# Altium project APE - Single Board Computer.PrjPcb (part 1 of 3)
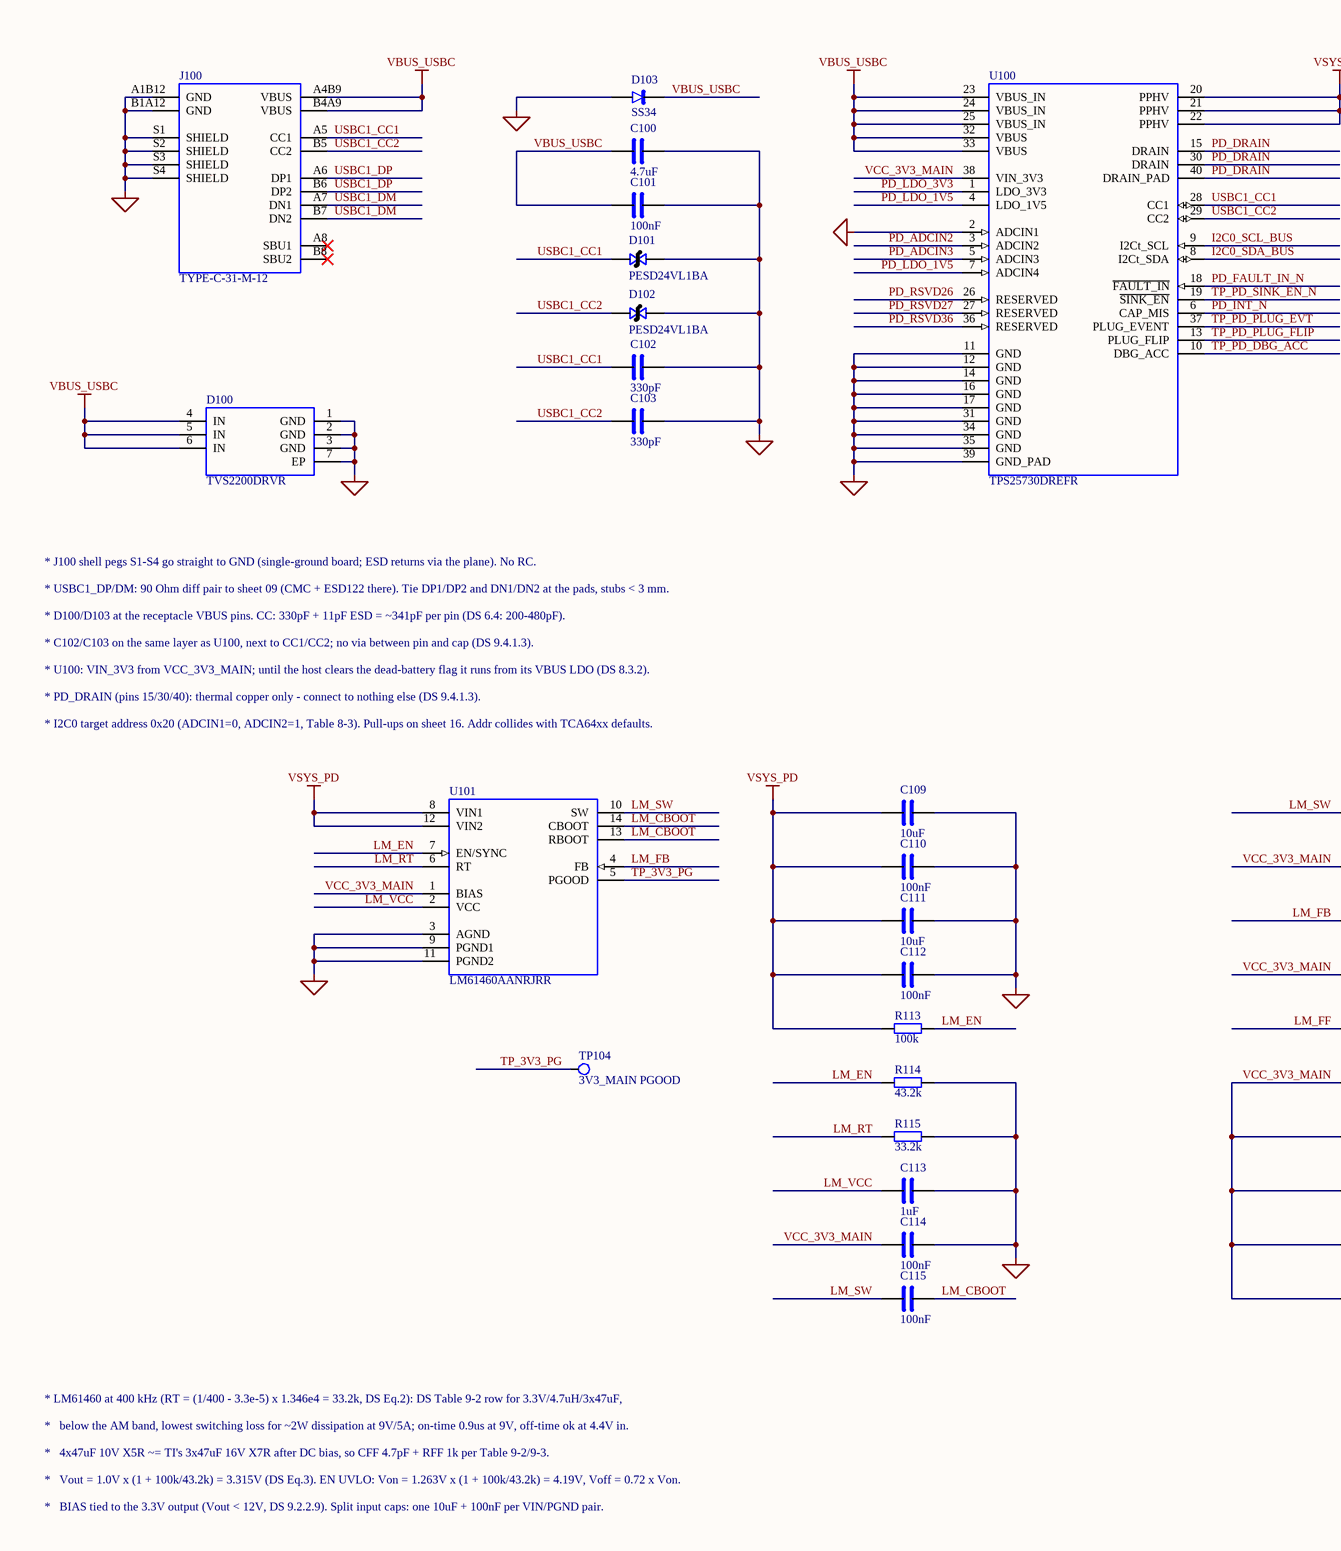
[diagram p0: 01_Power_Input.SchDoc, left]
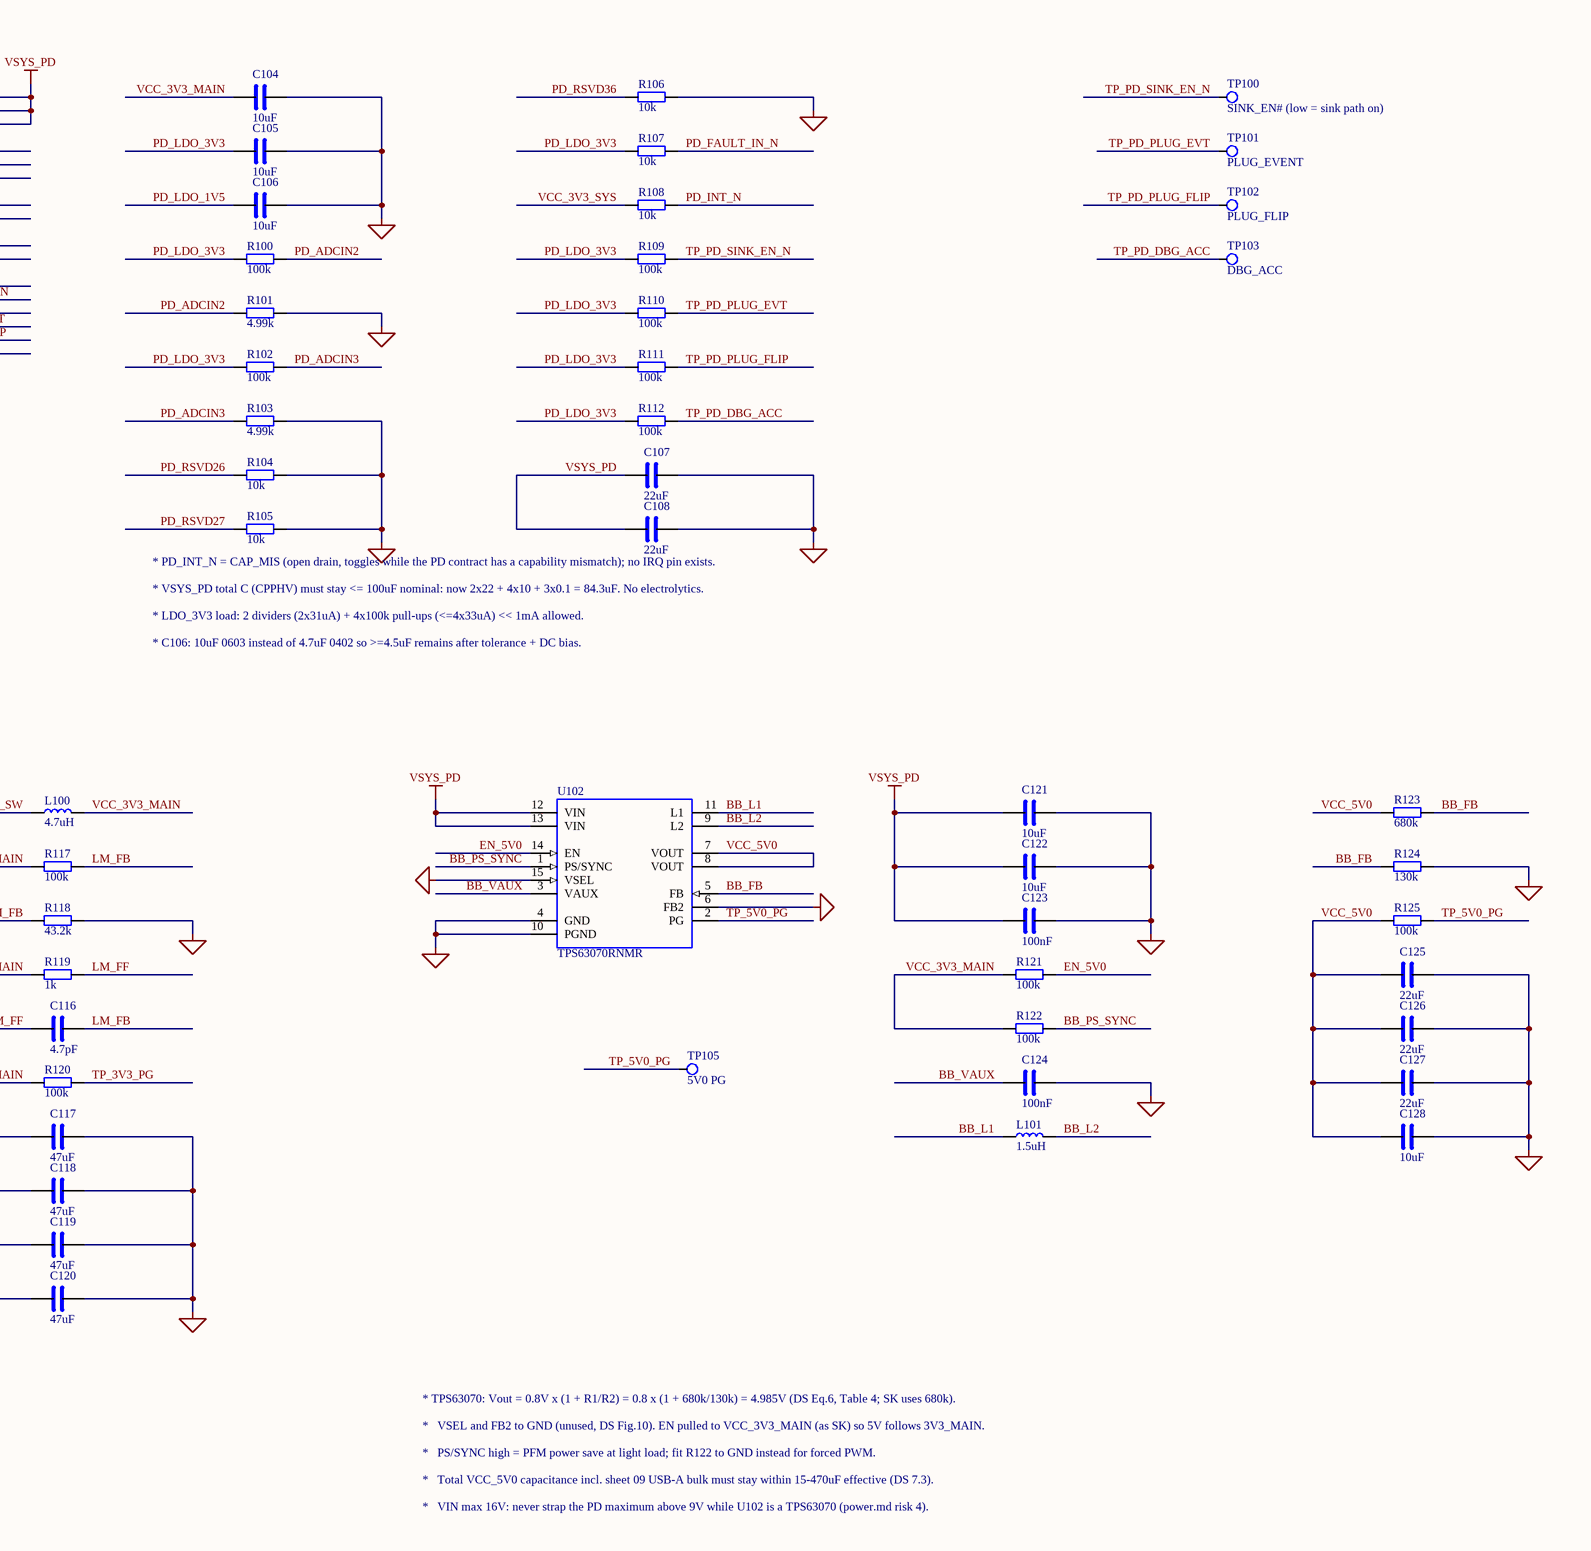
[diagram p1: 01_Power_Input.SchDoc, right]
16 sheets, 660 parts. Net scope: global (net labels, ports and power ports of the same name join across sheets).
Board file: PCB.PcbDoc
Sheets:
  01_Power_Input.SchDoc
  02_PMIC.SchDoc
  03_SiP_Power.SchDoc
  04_SiP_GND_NC.SchDoc
  05_SiP_IO.SchDoc
  06_Clock_Reset_Boot.SchDoc
  07_Storage.SchDoc
  08_Ethernet.SchDoc
  09_USB.SchDoc
  10_HDMI.SchDoc
  11_Audio.SchDoc
  12_Camera.SchDoc
  13_Wireless.SchDoc
  14_Expansion.SchDoc
  15_Debug.SchDoc
  16_Misc.SchDoc

## Sheet 01_Power_Input.SchDoc
size 812 x 508 mm; SheetNumber: 1; SheetTotal: 16

### Parts
C100  4.7uF  [C0805]
C101  100nF  [C0603]
C102  330pF  [C0402]
C103  330pF  [C0402]
C104  10uF  [C0603]
C105  10uF  [C0603]
C106  10uF  [C0603]
C107  22uF  [C1206]
C108  22uF  [C1206]
C109  10uF  [C1206]
C110  100nF  [C0603]
C111  10uF  [C1206]
C112  100nF  [C0603]
C113  1uF  [C0402]
C114  100nF  [C0402]
C115  100nF  [C0402]
C116  4.7pF  [C0402]
C117  47uF  [C1206]
C118  47uF  [C1206]
C119  47uF  [C1206]
C120  47uF  [C1206]
C121  10uF  [C0805]
C122  10uF  [C0805]
C123  100nF  [C0603]
C124  100nF  [C0402]
C125  22uF  [C1206]
C126  22uF  [C1206]
C127  22uF  [C1206]
C128  10uF  [C0603]
D100  TVS2200DRVR  [WSON6_DRV_2X2]
D101  PESD24VL1BA  [SOD323]
D102  PESD24VL1BA  [SOD323]
D103  SS34  [DIO_SMA]
J100  TYPE-C-31-M-12  [USB-C_HRO_TYPE-C-31-M-12]
L100  4.7uH  [IND_SUNLORD_MWSA0603S]
L101  1.5uH  [IND_SUNLORD_MWSA0402S]
R100  100k  [R0402]
R101  4.99k  [R0402]
R102  100k  [R0402]
R103  4.99k  [R0402]
R104  10k  [R0402]
R105  10k  [R0402]
R106  10k  [R0402]
R107  10k  [R0402]
R108  10k  [R0402]
R109  100k  [R0402]
R110  100k  [R0402]
R111  100k  [R0402]
R112  100k  [R0402]
R113  100k  [R0402]
R114  43.2k  [R0402]
R115  33.2k  [R0402]
R117  100k  [R0402]
R118  43.2k  [R0402]
R119  1k  [R0402]
R120  100k  [R0402]
R121  100k  [R0402]
R122  100k  [R0402]
R123  680k  [R0402]
R124  130k  [R0402]
R125  100k  [R0402]
TP100  SINK_EN# (low = sink path on)  [TP_PAD_1.0]
TP101  PLUG_EVENT  [TP_PAD_1.0]
TP102  PLUG_FLIP  [TP_PAD_1.0]
TP103  DBG_ACC  [TP_PAD_1.0]
TP104  3V3_MAIN PGOOD  [TP_PAD_1.0]
TP105  5V0 PG  [TP_PAD_1.0]
U100  TPS25730DREFR  [WQFN38_REF_4X6]
U101  LM61460AANRJRR  [VQFN-HR14_RJR_3.5X4]
U102  TPS63070RNMR  [VQFN-HR15_RNM_2.5X3]

### Nets
GND: C100.2 C101.2 C102.2 C103.2 C104.2 C105.2 C106.2 C107.2 C108.2 C109.2 C110.2 C111.2 C112.2 C113.2 C114.2 C117.2 C118.2 C119.2 C120.2 C121.2 C122.2 C123.2 C124.2 C125.2 C126.2 C127.2 C128.2 D100.1(GND) D100.2(GND) D100.3(GND) D100.7(EP) D101.2 D102.2 D103.1(A) J100.A1B12(GND) J100.B1A12(GND) J100.S1(SHIELD) J100.S2(SHIELD) J100.S3(SHIELD) J100.S4(SHIELD) R101.2 R103.2 R104.2 R105.2 R106.2 R114.2 R115.2 R118.2 R124.2 U100.2(ADCIN1) U100.11(GND) U100.12(GND) U100.14(GND) U100.16(GND) U100.17(GND) U100.31(GND) U100.34(GND) U100.35(GND) U100.39(GND_PAD) U101.3(AGND) U101.9(PGND1) U101.11(PGND2) U102.4(GND) U102.6(FB2) U102.10(PGND) U102.15(VSEL)
VBUS_USBC: C100.1 C101.1 D100.4(IN) D100.5(IN) D100.6(IN) D103.2(K) J100.A4B9(VBUS) J100.B4A9(VBUS) U100.23(VBUS_IN) U100.24(VBUS_IN) U100.25(VBUS_IN) U100.32(VBUS) U100.33(VBUS)
VCC_3V3_MAIN: C104.1 C114.1 C117.1 C118.1 C119.1 C120.1 L100.2 R117.1 R119.1 R120.1 R121.1 R122.1 U100.38(VIN_3V3) U101.1(BIAS)
VCC_3V3_SYS: R108.1
VCC_5V0: C125.1 C126.1 C127.1 C128.1 R123.1 R125.1 U102.7(VOUT) U102.8(VOUT)
VSYS_PD: C107.1 C108.1 C109.1 C110.1 C111.1 C112.1 C121.1 C122.1 C123.1 R113.1 U100.20(PPHV) U100.21(PPHV) U100.22(PPHV) U101.8(VIN1) U101.12(VIN2) U102.12(VIN) U102.13(VIN)
BB_FB: R123.2 R124.1 U102.5(FB)
BB_L1: L101.1 U102.11(L1)
BB_L2: L101.2 U102.9(L2)
BB_PS_SYNC: R122.2 U102.1(PS/SYNC)
BB_VAUX: C124.1 U102.3(VAUX)
EN_5V0: R121.2 U102.14(EN)
I2C0_SCL_BUS: U100.9(I2Ct_SCL)
I2C0_SDA_BUS: U100.8(I2Ct_SDA)
LM_CBOOT: C115.2 U101.13(RBOOT) U101.14(CBOOT)
LM_EN: R113.2 R114.1 U101.7(EN/SYNC)
LM_FB: C116.2 R117.2 R118.1 U101.4(FB)
LM_FF: C116.1 R119.2
LM_RT: R115.1 U101.6(RT)
LM_SW: C115.1 L100.1 U101.10(SW)
LM_VCC: C113.1 U101.2(VCC)
PD_ADCIN2: R100.2 R101.1 U100.3(ADCIN2)
PD_ADCIN3: R102.2 R103.1 U100.5(ADCIN3)
PD_DRAIN: U100.15(DRAIN) U100.30(DRAIN) U100.40(DRAIN_PAD)
PD_FAULT_IN_N: R107.2 U100.18(~{FAULT_IN})
PD_INT_N: R108.2 U100.6(CAP_MIS)
PD_LDO_1V5: C106.1 U100.4(LDO_1V5) U100.7(ADCIN4)
PD_LDO_3V3: C105.1 R100.1 R102.1 R107.1 R109.1 R110.1 R111.1 R112.1 U100.1(LDO_3V3)
PD_RSVD26: R104.1 U100.26(RESERVED)
PD_RSVD27: R105.1 U100.27(RESERVED)
PD_RSVD36: R106.1 U100.36(RESERVED)
TP_3V3_PG: R120.2 TP104.1(TP) U101.5(PGOOD)
TP_5V0_PG: R125.2 TP105.1(TP) U102.2(PG)
TP_PD_DBG_ACC: R112.2 TP103.1(TP) U100.10(DBG_ACC)
TP_PD_PLUG_EVT: R110.2 TP101.1(TP) U100.37(PLUG_EVENT)
TP_PD_PLUG_FLIP: R111.2 TP102.1(TP) U100.13(PLUG_FLIP)
TP_PD_SINK_EN_N: R109.2 TP100.1(TP) U100.19(~{SINK_EN})
USBC1_CC1: C102.1 D101.1 J100.A5(CC1) U100.28(CC1)
USBC1_CC2: C103.1 D102.1 J100.B5(CC2) U100.29(CC2)
USBC1_DM: J100.A7(DN1) J100.B7(DN2)
USBC1_DP: J100.A6(DP1) J100.B6(DP2)

Not connected (* = marked no-connect by the designer): J100 A8(SBU1)* B8(SBU2)*

### Notes on the sheet
- * J100 shell pegs S1-S4 go straight to GND (single-ground board; ESD returns via the plane). No RC.
- * USBC1_DP/DM: 90 Ohm diff pair to sheet 09 (CMC + ESD122 there). Tie DP1/DP2 and DN1/DN2 at the pads, stubs < 3 mm.
- * PD_INT_N = CAP_MIS (open drain, toggles while the PD contract has a capability mismatch); no IRQ pin exists.
- * VSYS_PD total C (CPPHV) must stay <= 100uF nominal: now 2x22 + 4x10 + 3x0.1 = 84.3uF. No electrolytics.
- * D100/D103 at the receptacle VBUS pins. CC: 330pF + 11pF ESD = ~341pF per pin (DS 6.4: 200-480pF).
- * C102/C103 on the same layer as U100, next to CC1/CC2; no via between pin and cap (DS 9.4.1.3).
- * U100: VIN_3V3 from VCC_3V3_MAIN; until the host clears the dead-battery flag it runs from its VBUS LDO (DS 8.3.2).
- * LDO_3V3 load: 2 dividers (2x31uA) + 4x100k pull-ups (<=4x33uA) << 1mA allowed.
- * C106: 10uF 0603 instead of 4.7uF 0402 so >=4.5uF remains after tolerance + DC bias.
- * PD_DRAIN (pins 15/30/40): thermal copper only - connect to nothing else (DS 9.4.1.3).
- * I2C0 target address 0x20 (ADCIN1=0, ADCIN2=1, Table 8-3). Pull-ups on sheet 16. Addr collides with TCA64xx defaults.
- * LM61460 at 400 kHz (RT = (1/400 - 3.3e-5) x 1.346e4 = 33.2k, DS Eq.2): DS Table 9-2 row for 3.3V/4.7uH/3x47uF,
- * TPS63070: Vout = 0.8V x (1 + R1/R2) = 0.8 x (1 + 680k/130k) = 4.985V (DS Eq.6, Table 4; SK uses 680k).
- *   below the AM band, lowest switching loss for ~2W dissipation at 9V/5A; on-time 0.9us at 9V, off-time ok at 4.4V in.
- *   4x47uF 10V X5R ~= TI's 3x47uF 16V X7R after DC bias, so CFF 4.7pF + RFF 1k per Table 9-2/9-3.
- *   Vout = 1.0V x (1 + 100k/43.2k) = 3.315V (DS Eq.3). EN UVLO: Von = 1.263V x (1 + 100k/43.2k) = 4.19V, Voff = 0.72 x Von.
- *   VSEL and FB2 to GND (unused, DS Fig.10). EN pulled to VCC_3V3_MAIN (as SK) so 5V follows 3V3_MAIN.
- *   PS/SYNC high = PFM power save at light load; fit R122 to GND instead for forced PWM.
- *   Total VCC_5V0 capacitance incl. sheet 09 USB-A bulk must stay within 15-470uF effective (DS 7.3).
- *   BIAS tied to the 3.3V output (Vout < 12V, DS 9.2.2.9). Split input caps: one 10uF + 100nF per VIN/PGND pair.
- *   VIN max 16V: never strap the PD maximum above 9V while U102 is a TPS63070 (power.md risk 4).

### Library data of the parts
C100 = CAP: Capacitor, non-polarized; MPN: CL21A475KAQNNNE; Manufacturer: Samsung; Spec: 4.7uF 25V X5R 0805 (CVBUS; total VBUS C must stay <= 10 uF)
C101 = CAP: Capacitor, non-polarized; MPN: CC0603KRX7R9BB104; Manufacturer: YAGEO; Spec: 100nF 50V X7R 0603 (VBUS HF)
C102 C103 = CAP: Capacitor, non-polarized; Spec: 330pF 50V C0G 0402 (CCCy)
C104 = CAP: Capacitor, non-polarized; MPN: CL10A106KP8NNNC; Manufacturer: Samsung; Spec: 10uF 10V X5R 0603 (CVIN_3V3)
C105 = CAP: Capacitor, non-polarized; MPN: CL10A106KP8NNNC; Manufacturer: Samsung; Spec: 10uF 10V X5R 0603 (CLDO_3V3 5-25uF)
C106 = CAP: Capacitor, non-polarized; MPN: CL10A106KP8NNNC; Manufacturer: Samsung; Spec: 10uF 10V X5R 0603 (CLDO_1V5 4.5-12uF)
C107 C108 = CAP: Capacitor, non-polarized; MPN: CL31A226KAHNNNE; Manufacturer: Samsung; Spec: 22uF 25V X5R 1206 (CPPHV bulk)
C109 = CAP: Capacitor, non-polarized; MPN: CL31A106KBHNNNE; Manufacturer: Samsung; Spec: 10uF 50V X5R 1206 (VIN1/PGND1)
C110 = CAP: Capacitor, non-polarized; MPN: CC0603KRX7R9BB104; Manufacturer: YAGEO; Spec: 100nF 50V X7R 0603 (VIN1/PGND1 HF)
C111 = CAP: Capacitor, non-polarized; MPN: CL31A106KBHNNNE; Manufacturer: Samsung; Spec: 10uF 50V X5R 1206 (VIN2/PGND2)
C112 = CAP: Capacitor, non-polarized; MPN: CC0603KRX7R9BB104; Manufacturer: YAGEO; Spec: 100nF 50V X7R 0603 (VIN2/PGND2 HF)
C113 = CAP: Capacitor, non-polarized; Spec: 1uF 25V X5R 0402 (VCC)
C114 = CAP: Capacitor, non-polarized; Spec: 100nF 16V X7R 0402 (at BIAS pin)
C115 = CAP: Capacitor, non-polarized; Spec: 100nF 16V X7R 0402 (CBOOT)
C116 = CAP: Capacitor, non-polarized; Spec: 4.7pF 50V C0G 0402 (CFF)
C117-C120 = CAP: Capacitor, non-polarized; MPN: CL31A476MPHNNNE; Manufacturer: Samsung; Spec: 47uF 10V X5R 1206 (COUT)
C121 C122 = CAP: Capacitor, non-polarized; MPN: CL21A106KAYNNNE; Manufacturer: Samsung; Spec: 10uF 25V X5R 0805 (CIN)
C123 = CAP: Capacitor, non-polarized; MPN: CC0603KRX7R9BB104; Manufacturer: YAGEO; Spec: 100nF 50V X7R 0603 (VIN HF, at pins)
C124 = CAP: Capacitor, non-polarized; Spec: 100nF 16V X7R 0402 (VAUX)
C125-C127 = CAP: Capacitor, non-polarized; MPN: CL31A226KAHNNNE; Manufacturer: Samsung; Spec: 22uF 25V X5R 1206 (COUT)
C128 = CAP: Capacitor, non-polarized; MPN: CL10A106KP8NNNC; Manufacturer: Samsung; Spec: 10uF 10V X5R 0603 (VOUT bypass at pins)
D100 = TVS2200_DRV: TVS2200 22 V flat-clamp surge protection, WSON-6 2x2; Manufacturer: Texas Instruments; MPN: TVS2200DRVR
D101 = TVS_BI: Bidirectional TVS / ESD diode; MPN: PESD24VL1BA,115; Manufacturer: Nexperia; Spec: PESD24VL1BA CC1 ESD (11pF)
D102 = TVS_BI: Bidirectional TVS / ESD diode; MPN: PESD24VL1BA,115; Manufacturer: Nexperia; Spec: PESD24VL1BA CC2 ESD (11pF)
D103 = DIODE: Diode (pin 1 = anode); Manufacturer: MDD; Spec: SS34 40V 3A Schottky (TPS25730 DS 8.5); MPN: SS34
J100 = TYPE-C-31-M-12: USB Type-C receptacle, USB 2.0 16-contact, SMD R/A, 4 THT shell pegs; Manufacturer: Korean Hroparts Elec; MPN: TYPE-C-31-M-12
L100 = IND: Inductor; MPN: MWSA0603S-4R7MT; Manufacturer: Sunlord; Spec: 4.7uH MWSA0603S-4R7MT (Isat 9A, 33mOhm)
L101 = IND: Inductor; MPN: MWSA0402S-1R5MT; Manufacturer: Sunlord; Spec: 1.5uH MWSA0402S-1R5MT (Isat 5.5A)
R100 = RES: Resistor; Spec: 100k 1% 0402 (ADCIN2 up)
R101 = RES: Resistor; Spec: 4.99k 1% 0402 (ADCIN2 dn: max 9V)
R102 = RES: Resistor; Spec: 100k 1% 0402 (ADCIN3 up)
R103 = RES: Resistor; Spec: 4.99k 1% 0402 (ADCIN3 dn: 1.5A op)
R104-R106 = RES: Resistor; Spec: 10k 1% 0402 (RESERVED)
R107 = RES: Resistor; Spec: 10k 1% 0402 (FAULT_IN high = no fault)
R108 = RES: Resistor; Spec: 10k 1% 0402 (SoC-side pull-up)
R109-R112 = RES: Resistor; Spec: 100k 1% 0402
R113 = RES: Resistor; Spec: 100k 1% 0402 (RENT)
R114 = RES: Resistor; Spec: 43.2k 1% 0402 (RENB: UVLO on 4.19V, off 3.0V)
R115 = RES: Resistor; Spec: 33.2k 1% 0402 (RT: 400kHz)
R117 = RES: Resistor; Spec: 100k 1% 0402 (RFBT)
R118 = RES: Resistor; Spec: 43.2k 1% 0402 (RFBB: 3.315V)
R119 = RES: Resistor; Spec: 1k 1% 0402 (RFF)
R120 = RES: Resistor; Spec: 100k 1% 0402 (PGOOD pull-up)
R121 = RES: Resistor; Spec: 100k 1% 0402 (EN: on with 3V3_MAIN)
R122 = RES: Resistor; Spec: 100k 1% 0402 (PS high: power save)
R123 = RES: Resistor; Spec: 680k 1% 0402 (R1)
R124 = RES: Resistor; Spec: 130k 1% 0402 (R2: 4.985V)
R125 = RES: Resistor; Spec: 100k 1% 0402 (PG pull-up)
TP100-TP105 = TESTPOINT: Test point
U100 = TPS25730D_REF: TPS25730D USB-C PD sink controller, 5 A integrated power path, WQFN-38 REF; Manufacturer: Texas Instruments; MPN: TPS25730DREFR
U101 = LM61460_RJR: LM61460 36 V 6 A synchronous buck, adjustable, VQFN-HR-14 RJR; Manufacturer: Texas Instruments; MPN: LM61460AANRJRR
U102 = TPS63070_RNM: TPS63070 2-16 V 3.6 A buck-boost, adjustable, VQFN-HR-15 RNM; Manufacturer: Texas Instruments; MPN: TPS63070RNMR

## Sheet 02_PMIC.SchDoc
size 508 x 381 mm; SheetNumber: 2; SheetTotal: 16
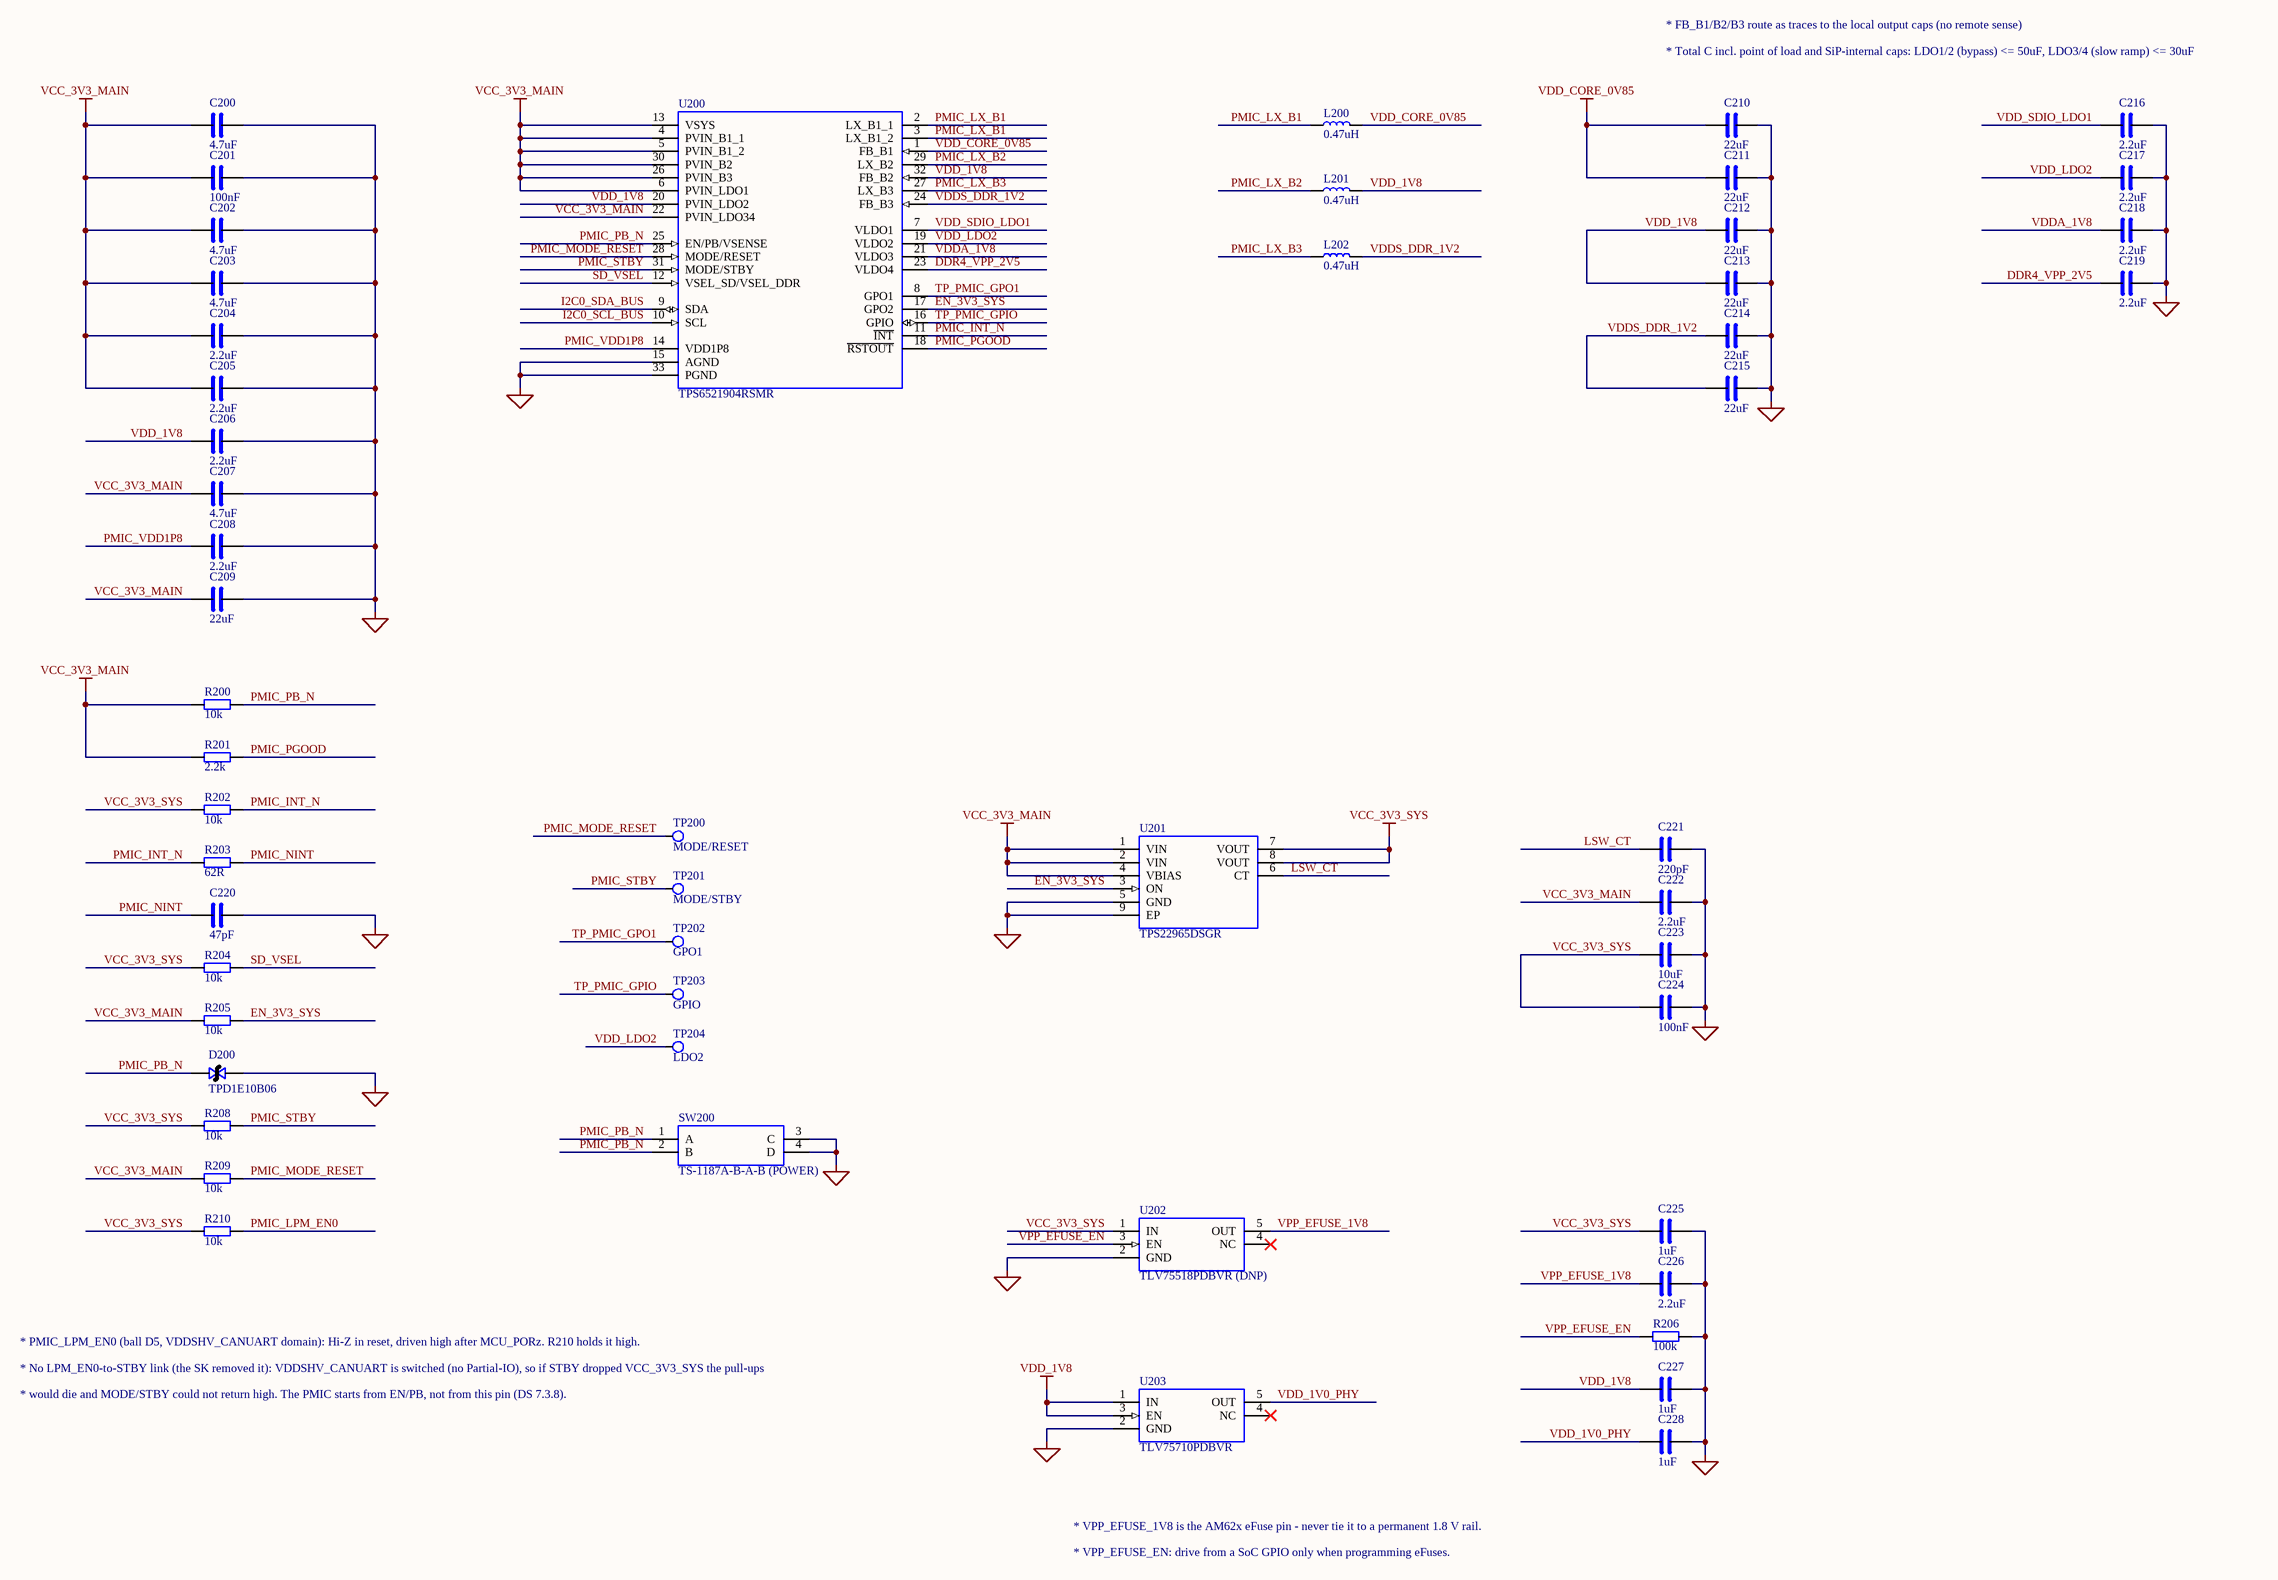
[diagram p2: 02_PMIC.SchDoc]

### Parts
C200  4.7uF  [C0603]
C201  100nF  [C0402]
C202  4.7uF  [C0603]
C203  4.7uF  [C0603]
C204  2.2uF  [C0402]
C205  2.2uF  [C0402]
C206  2.2uF  [C0402]
C207  4.7uF  [C0603]
C208  2.2uF  [C0402]
C209  22uF  [C0805]
C210  22uF  [C0805]
C211  22uF  [C0805]
C212  22uF  [C0805]
C213  22uF  [C0805]
C214  22uF  [C0805]
C215  22uF  [C0805]
C216  2.2uF  [C0402]
C217  2.2uF  [C0402]
C218  2.2uF  [C0402]
C219  2.2uF  [C0402]
C220  47pF  [C0402]
C221  220pF  [C0402]
C222  2.2uF  [C0402]
C223  10uF  [C0603]
C224  100nF  [C0402]
C225  1uF  [C0402]
C226  2.2uF  [C0402]
C227  1uF  [C0402]
C228  1uF  [C0402]
D200  TPD1E10B06  [X1SON2_DPY]
L200  0.47uH  [IND_MURATA_DFE252012F]
L201  0.47uH  [IND_MURATA_DFE252012F]
L202  0.47uH  [IND_MURATA_DFE252012F]
R200  10k  [R0402]
R201  2.2k  [R0402]
R202  10k  [R0402]
R203  62R  [R0402]
R204  10k  [R0402]
R205  10k  [R0402]
R206  100k  [R0402]
R208  10k  [R0402]
R209  10k  [R0402]
R210  10k  [R0402]
SW200  TS-1187A-B-A-B (POWER)  [SW_TACT_5.1X5.1_SMD4]
TP200  MODE/RESET  [TP_PAD_1.0]
TP201  MODE/STBY  [TP_PAD_1.0]
TP202  GPO1  [TP_PAD_1.0]
TP203  GPIO  [TP_PAD_1.0]
TP204  LDO2  [TP_PAD_1.0]
U200  TPS6521904RSMR  [VQFN32_RSM_4X4]
U201  TPS22965DSGR  [WSON8_DSG_2X2]
U202  TLV75518PDBVR (DNP)  [SOT23-5]
U203  TLV75710PDBVR  [SOT23-5]

### Nets
GND: C200.2 C201.2 C202.2 C203.2 C204.2 C205.2 C206.2 C207.2 C208.2 C209.2 C210.2 C211.2 C212.2 C213.2 C214.2 C215.2 C216.2 C217.2 C218.2 C219.2 C220.2 C221.2 C222.2 C223.2 C224.2 C225.2 C226.2 C227.2 C228.2 D200.2 R206.2 SW200.3(C) SW200.4(D) U200.15(AGND) U200.33(PGND) U201.5(GND) U201.9(EP) U202.2(GND) U203.2(GND)
VCC_3V3_MAIN: C200.1 C201.1 C202.1 C203.1 C204.1 C205.1 C207.1 C209.1 C222.1 R200.1 R201.1 R205.1 R209.1 U200.4(PVIN_B1_1) U200.5(PVIN_B1_2) U200.6(PVIN_LDO1) U200.13(VSYS) U200.22(PVIN_LDO34) U200.26(PVIN_B3) U200.30(PVIN_B2) U201.1(VIN) U201.2(VIN) U201.4(VBIAS)
VCC_3V3_SYS: C223.1 C224.1 C225.1 R202.1 R204.1 R208.1 R210.1 U201.7(VOUT) U201.8(VOUT) U202.1(IN)
VDD_1V0_PHY: C228.1 U203.5(OUT)
VDD_1V8: C206.1 C212.1 C213.1 C227.1 L201.2 U200.20(PVIN_LDO2) U200.32(FB_B2) U203.1(IN) U203.3(EN)
VDD_CORE_0V85: C210.1 C211.1 L200.2 U200.1(FB_B1)
VPP_EFUSE_1V8: C226.1 U202.5(OUT)
DDR4_VPP_2V5: C219.1 U200.23(VLDO4)
EN_3V3_SYS: R205.2 U200.17(GPO2) U201.3(ON)
I2C0_SCL_BUS: U200.10(SCL)
I2C0_SDA_BUS: U200.9(SDA)
LSW_CT: C221.1 U201.6(CT)
PMIC_INT_N: R202.2 R203.1 U200.11(~{INT})
PMIC_LPM_EN0: R210.2
PMIC_LX_B1: L200.1 U200.2(LX_B1_1) U200.3(LX_B1_2)
PMIC_LX_B2: L201.1 U200.29(LX_B2)
PMIC_LX_B3: L202.1 U200.27(LX_B3)
PMIC_MODE_RESET: R209.2 TP200.1(TP) U200.28(MODE/RESET)
PMIC_NINT: C220.1 R203.2
PMIC_PB_N: D200.1 R200.2 SW200.1(A) SW200.2(B) U200.25(EN/PB/VSENSE)
PMIC_PGOOD: R201.2 U200.18(~{RSTOUT})
PMIC_STBY: R208.2 TP201.1(TP) U200.31(MODE/STBY)
PMIC_VDD1P8: C208.1 U200.14(VDD1P8)
SD_VSEL: R204.2 U200.12(VSEL_SD/VSEL_DDR)
TP_PMIC_GPIO: TP203.1(TP) U200.16(GPIO)
TP_PMIC_GPO1: TP202.1(TP) U200.8(GPO1)
VDD_LDO2: C217.1 TP204.1(TP) U200.19(VLDO2)
VDD_SDIO_LDO1: C216.1 U200.7(VLDO1)
VDDA_1V8: C218.1 U200.21(VLDO3)
VDDS_DDR_1V2: C214.1 C215.1 L202.2 U200.24(FB_B3)
VPP_EFUSE_EN: R206.1 U202.3(EN)

Not connected (* = marked no-connect by the designer): U202 4(NC)*; U203 4(NC)*

### Notes on the sheet
- * FB_B1/B2/B3 route as traces to the local output caps (no remote sense)
- * Total C incl. point of load and SiP-internal caps: LDO1/2 (bypass) <= 50uF, LDO3/4 (slow ramp) <= 30uF
- * PMIC_LPM_EN0 (ball D5, VDDSHV_CANUART domain): Hi-Z in reset, driven high after MCU_PORz. R210 holds it high.
- * No LPM_EN0-to-STBY link (the SK removed it): VDDSHV_CANUART is switched (no Partial-IO), so if STBY dropped VCC_3V3_SYS the pull-ups
- * would die and MODE/STBY could not return high. The PMIC starts from EN/PB, not from this pin (DS 7.3.8).
- * VPP_EFUSE_1V8 is the AM62x eFuse pin - never tie it to a permanent 1.8 V rail.
- * VPP_EFUSE_EN: drive from a SoC GPIO only when programming eFuses.

### Library data of the parts
C200 = CAP: Capacitor, non-polarized; Spec: 4.7uF 10V X5R 0603 (PVIN_B1)
C201 = CAP: Capacitor, non-polarized; Spec: 100nF 16V X7R 0402 (PVIN_B1)
C202 = CAP: Capacitor, non-polarized; Spec: 4.7uF 10V X5R 0603 (PVIN_B2)
C203 = CAP: Capacitor, non-polarized; Spec: 4.7uF 10V X5R 0603 (PVIN_B3)
C204 = CAP: Capacitor, non-polarized; Spec: 2.2uF 10V X5R 0402 (VSYS)
C205 = CAP: Capacitor, non-polarized; Spec: 2.2uF 10V X5R 0402 (PVIN_LDO1)
C206 = CAP: Capacitor, non-polarized; Spec: 2.2uF 10V X5R 0402 (PVIN_LDO2)
C207 = CAP: Capacitor, non-polarized; Spec: 4.7uF 10V X5R 0603 (PVIN_LDO34)
C208 = CAP: Capacitor, non-polarized; Spec: 2.2uF 10V X5R 0402 (VDD1P8, no load)
C209 = CAP: Capacitor, non-polarized; Spec: 22uF 6.3V X5R 0805 (bulk)
C210 C211 = CAP: Capacitor, non-polarized; Spec: 22uF 6.3V X5R 0805 (Buck1 out)
C212 C213 = CAP: Capacitor, non-polarized; Spec: 22uF 6.3V X5R 0805 (Buck2 out)
C214 C215 = CAP: Capacitor, non-polarized; Spec: 22uF 6.3V X5R 0805 (Buck3 out)
C216 = CAP: Capacitor, non-polarized; Spec: 2.2uF 10V X5R 0402 (LDO1 out)
C217 = CAP: Capacitor, non-polarized; Spec: 2.2uF 10V X5R 0402 (LDO2 out, unused)
C218 = CAP: Capacitor, non-polarized; Spec: 2.2uF 10V X5R 0402 (LDO3 out)
C219 = CAP: Capacitor, non-polarized; Spec: 2.2uF 10V X5R 0402 (LDO4 out)
C220 = CAP: Capacitor, non-polarized; Spec: 47pF 50V C0G 0402
C221 = CAP: Capacitor, non-polarized; Spec: 220pF 50V C0G 0402 (CT: IO supply slew)
C222 = CAP: Capacitor, non-polarized; Spec: 2.2uF 10V X5R 0402 (VIN)
C223 = CAP: Capacitor, non-polarized; Spec: 10uF 10V X5R 0603 (VOUT)
C224 = CAP: Capacitor, non-polarized; Spec: 100nF 16V X7R 0402 (VOUT)
C225 = CAP: Capacitor, non-polarized; DNP: 1; Spec: 1uF 10V X5R 0402 (VPP LDO in, DNP)
C226 = CAP: Capacitor, non-polarized; DNP: 1; Spec: 2.2uF 10V X5R 0402 (VPP LDO out, DNP)
C227 = CAP: Capacitor, non-polarized; Spec: 1uF 10V X5R 0402 (PHY LDO in)
C228 = CAP: Capacitor, non-polarized; Spec: 1uF 10V X5R 0402 (PHY LDO out)
D200 = TVS_BI: Bidirectional TVS / ESD diode; Spec: TPD1E10B06 ESD
L200 = IND: Inductor; MPN: DFE252012F-R47M=P2; Manufacturer: Murata; Spec: 0.47uH DFE252012F-R47M (Buck1, Isat 6.7A)
L201 = IND: Inductor; MPN: DFE252012F-R47M=P2; Manufacturer: Murata; Spec: 0.47uH DFE252012F-R47M (Buck2)
L202 = IND: Inductor; MPN: DFE252012F-R47M=P2; Manufacturer: Murata; Spec: 0.47uH DFE252012F-R47M (Buck3)
R200 R202 = RES: Resistor; Spec: 10k 0402
R201 = RES: Resistor; Spec: 2.2k 0402 (fast edge into the MCU_PORz gate, sheet 06)
R203 = RES: Resistor; Spec: 62R 0402 (slew limiter, SK rev B)
R204 = RES: Resistor; Spec: 10k 0402 (SD starts at 3.3 V)
R205 = RES: Resistor; Spec: 10k 0402 (GPO2 is open drain)
R206 = RES: Resistor; Spec: 100k 0402 (keeps VPP off)
R208 = RES: Resistor; Spec: 10k 0402 (MODE/STBY high = ACTIVE + forced PWM, SK R621)
R209 = RES: Resistor; Spec: 10k 0402 (MODE/RESET high = no reset)
R210 = RES: Resistor; Spec: 10k 0402 (Octavo 62_CONFIG_9: to the VDDSHV_CANUART source)
SW200 = TS-1187A: Tactile switch SPST-NO 5.1x5.1 mm, 4 terminals (A=B, C=D); Manufacturer: XKB Connection; MPN: TS-1187A-B-A-B
TP200-TP204 = TESTPOINT: Test point
U200 = TPS65219: TPS65219 PMIC, 3 bucks + 4 LDOs, VQFN-32 RHB/RSM (NVM per OPN); Manufacturer: Texas Instruments; MPN: TPS6521904RSMR
U201 = TPS22965_DSG: TPS22965 5.7 V 4 A load switch with controlled rise time, WSON-8; Manufacturer: Texas Instruments; MPN: TPS22965DSGR
U202 = TLV755P_DBV: TLV755P 500 mA LDO, SOT-23-5 (fixed output per OPN); Manufacturer: Texas Instruments; DNP: 1; MPN: TLV75518PDBVR
U203 = TLV755P_DBV: TLV755P 500 mA LDO, SOT-23-5 (fixed output per OPN); Manufacturer: Texas Instruments; MPN: TLV75710PDBVR

## Sheet 03_SiP_Power.SchDoc
size 812 x 508 mm; SheetNumber: 3; SheetTotal: 16
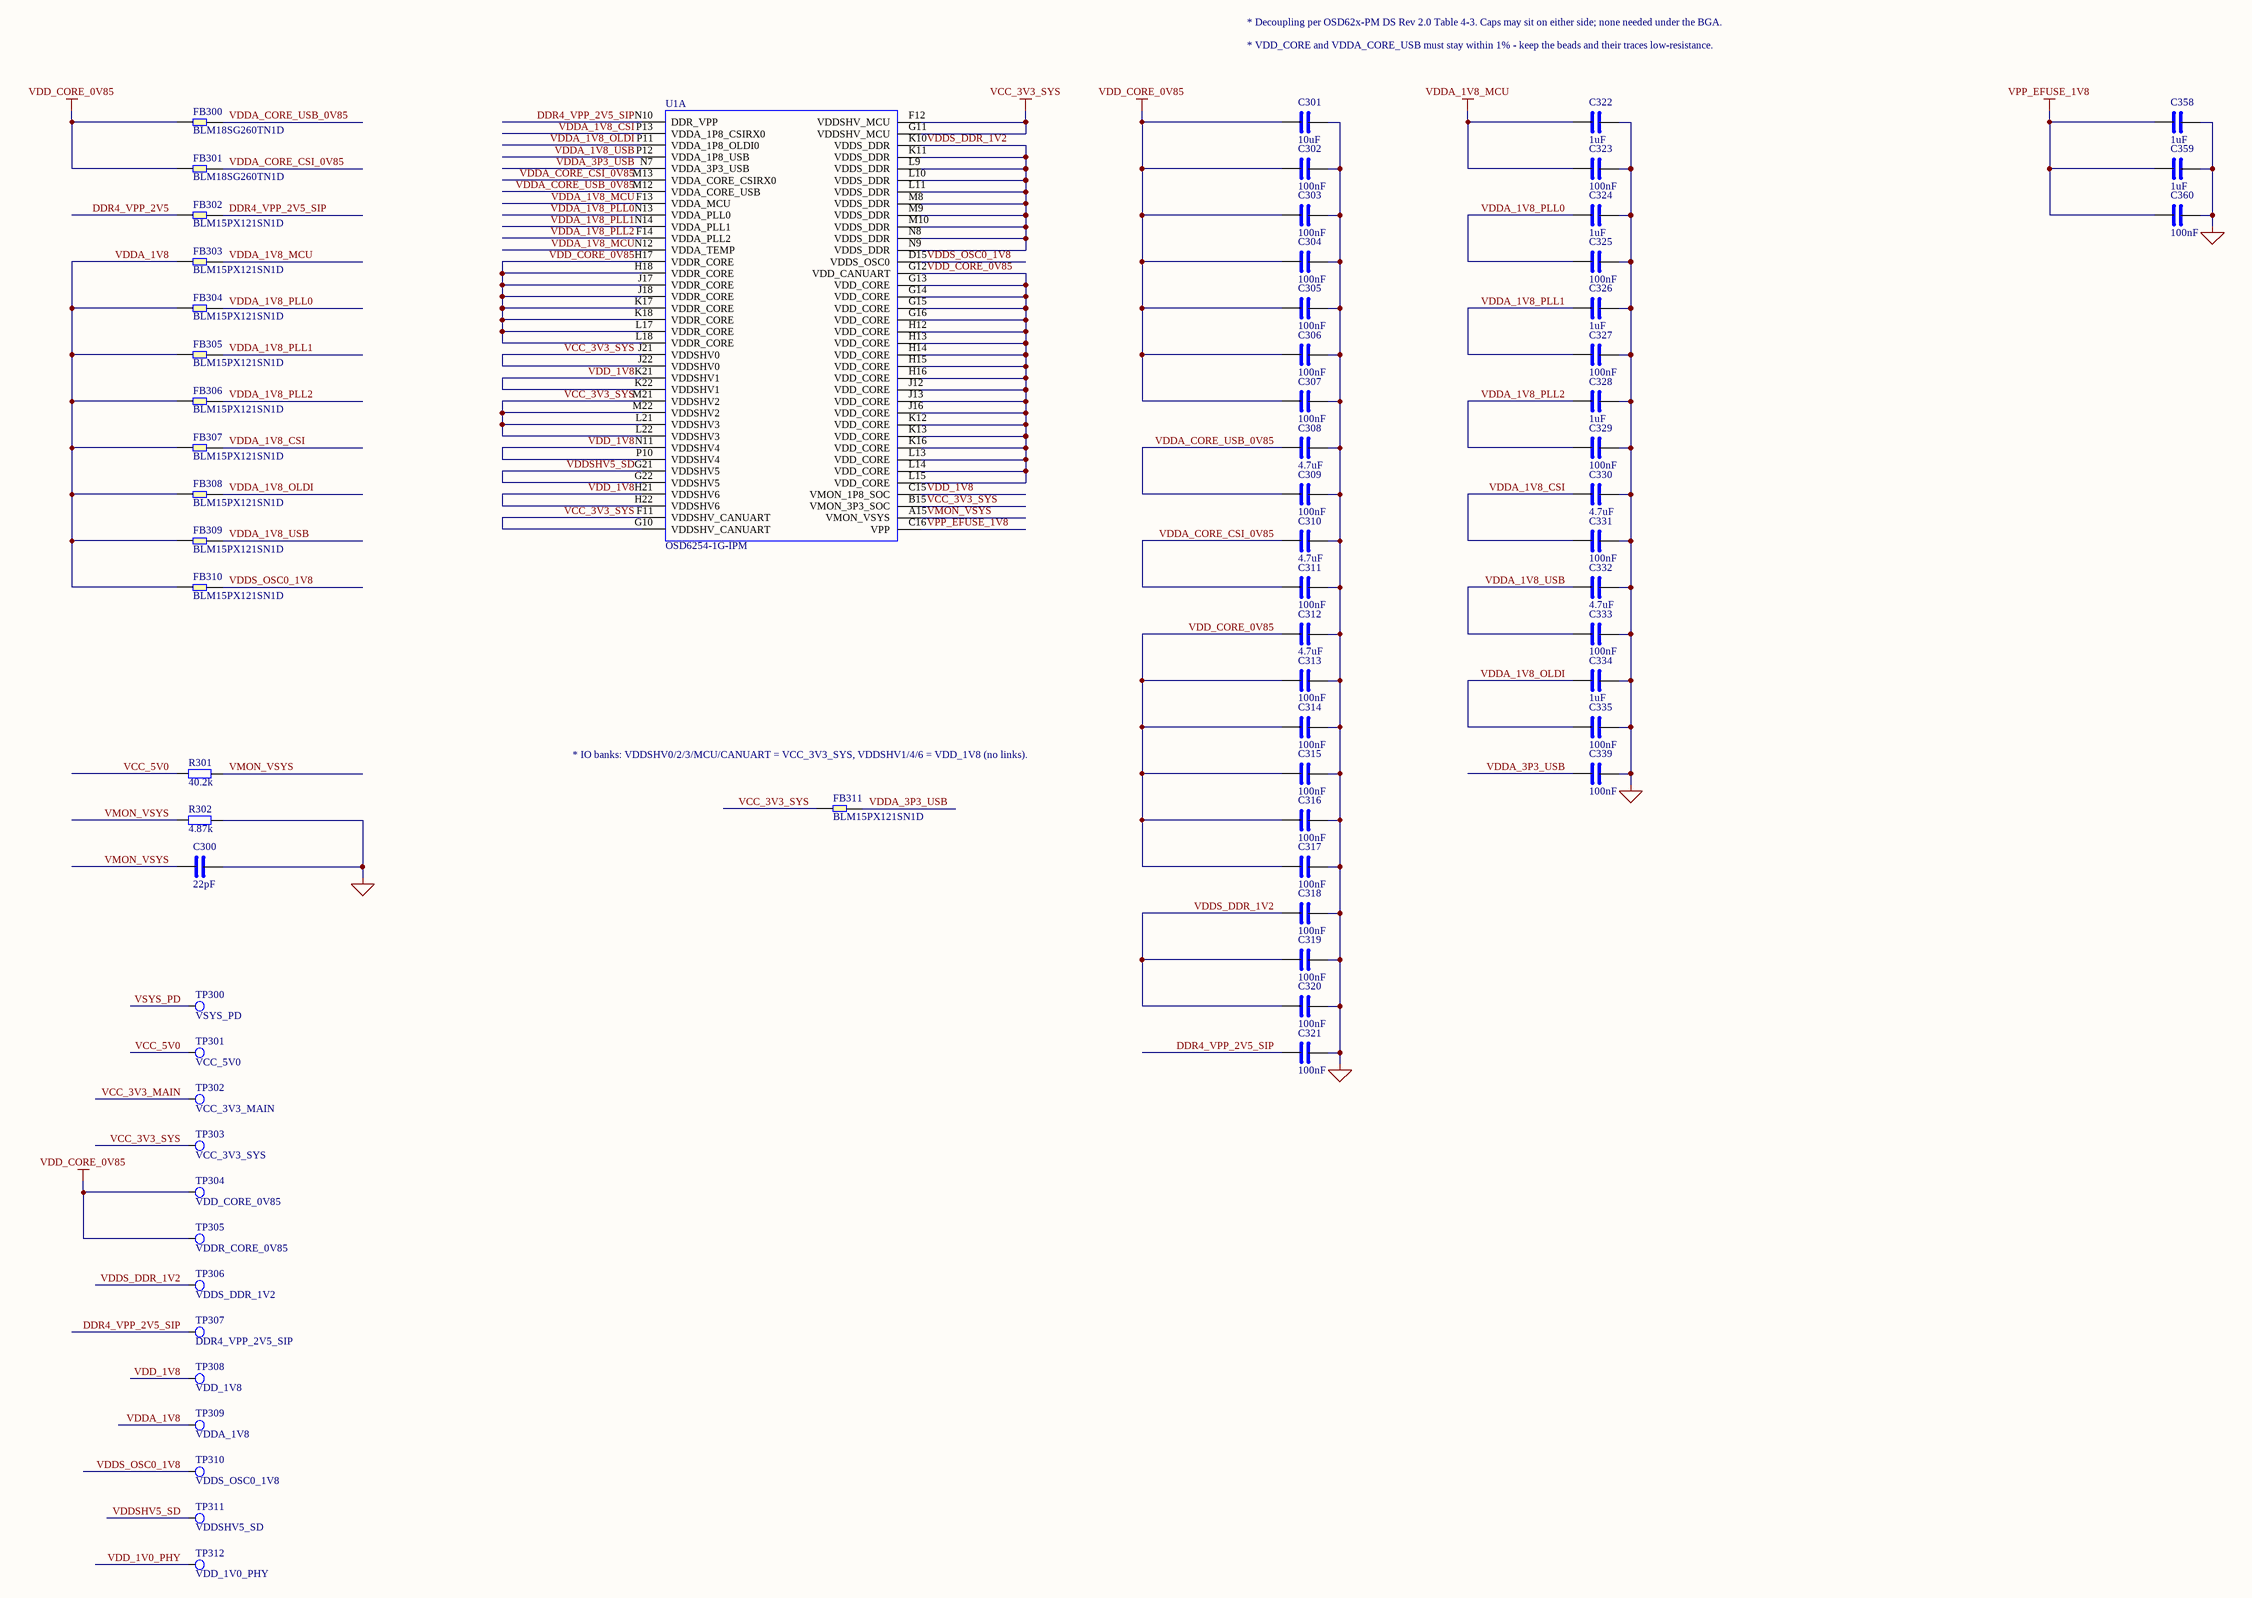
[diagram p3: 03_SiP_Power.SchDoc]

### Parts
C300  22pF  [C0402]
C301  10uF  [C0603]
C302  100nF  [C0402]
C303  100nF  [C0402]
C304  100nF  [C0402]
C305  100nF  [C0402]
C306  100nF  [C0402]
C307  100nF  [C0402]
C308  4.7uF  [C0402]
C309  100nF  [C0402]
C310  4.7uF  [C0402]
C311  100nF  [C0402]
C312  4.7uF  [C0402]
C313  100nF  [C0402]
C314  100nF  [C0402]
C315  100nF  [C0402]
C316  100nF  [C0402]
C317  100nF  [C0402]
C318  100nF  [C0402]
C319  100nF  [C0402]
C320  100nF  [C0402]
C321  100nF  [C0402]
C322  1uF  [C0402]
C323  100nF  [C0402]
C324  1uF  [C0402]
C325  100nF  [C0402]
C326  1uF  [C0402]
C327  100nF  [C0402]
C328  1uF  [C0402]
C329  100nF  [C0402]
C330  4.7uF  [C0402]
C331  100nF  [C0402]
C332  4.7uF  [C0402]
C333  100nF  [C0402]
C334  1uF  [C0402]
C335  100nF  [C0402]
C339  100nF  [C0402]
C358  1uF  [C0402]
C359  1uF  [C0402]
C360  100nF  [C0402]
FB300  BLM18SG260TN1D  [FB0603]
FB301  BLM18SG260TN1D  [FB0603]
FB302  BLM15PX121SN1D  [FB0402]
FB303  BLM15PX121SN1D  [FB0402]
FB304  BLM15PX121SN1D  [FB0402]
FB305  BLM15PX121SN1D  [FB0402]
FB306  BLM15PX121SN1D  [FB0402]
FB307  BLM15PX121SN1D  [FB0402]
FB308  BLM15PX121SN1D  [FB0402]
FB309  BLM15PX121SN1D  [FB0402]
FB310  BLM15PX121SN1D  [FB0402]
FB311  BLM15PX121SN1D  [FB0402]
R301  40.2k  [R0402]
R302  4.87k  [R0402]
TP300  VSYS_PD  [TP_PAD_1.0]
TP301  VCC_5V0  [TP_PAD_1.0]
TP302  VCC_3V3_MAIN  [TP_PAD_1.0]
TP303  VCC_3V3_SYS  [TP_PAD_1.0]
TP304  VDD_CORE_0V85  [TP_PAD_1.0]
TP305  VDDR_CORE_0V85  [TP_PAD_1.0]
TP306  VDDS_DDR_1V2  [TP_PAD_1.0]
TP307  DDR4_VPP_2V5_SIP  [TP_PAD_1.0]
TP308  VDD_1V8  [TP_PAD_1.0]
TP309  VDDA_1V8  [TP_PAD_1.0]
TP310  VDDS_OSC0_1V8  [TP_PAD_1.0]
TP311  VDDSHV5_SD  [TP_PAD_1.0]
TP312  VDD_1V0_PHY  [TP_PAD_1.0]
U1  OSD6254-1G-IPM  [OSD62X-PM_BGA500]  (part A of 9)

### Nets
GND: C300.2 C301.2 C302.2 C303.2 C304.2 C305.2 C306.2 C307.2 C308.2 C309.2 C310.2 C311.2 C312.2 C313.2 C314.2 C315.2 C316.2 C317.2 C318.2 C319.2 C320.2 C321.2 C322.2 C323.2 C324.2 C325.2 C326.2 C327.2 C328.2 C329.2 C330.2 C331.2 C332.2 C333.2 C334.2 C335.2 C339.2 C358.2 C359.2 C360.2 R302.2
VCC_3V3_MAIN: TP302.1(TP)
VCC_3V3_SYS: FB311.1 TP303.1(TP) U1.B15(VMON_3P3_SOC) U1.F11(VDDSHV_CANUART) U1.F12(VDDSHV_MCU) U1.G10(VDDSHV_CANUART) U1.G11(VDDSHV_MCU) U1.J21(VDDSHV0) U1.J22(VDDSHV0) U1.L21(VDDSHV3) U1.L22(VDDSHV3) U1.M21(VDDSHV2) U1.M22(VDDSHV2)
VCC_5V0: R301.1 TP301.1(TP)
VDD_1V0_PHY: TP312.1(TP)
VDD_1V8: TP308.1(TP) U1.C15(VMON_1P8_SOC) U1.H21(VDDSHV6) U1.H22(VDDSHV6) U1.K21(VDDSHV1) U1.K22(VDDSHV1) U1.N11(VDDSHV4) U1.P10(VDDSHV4)
VDD_CORE_0V85: C301.1 C302.1 C303.1 C304.1 C305.1 C306.1 C307.1 C312.1 C313.1 C314.1 C315.1 C316.1 C317.1 FB300.1 FB301.1 TP304.1(TP) TP305.1(TP) U1.G12(VDD_CANUART) U1.G13(VDD_CORE) U1.G14(VDD_CORE) U1.G15(VDD_CORE) U1.G16(VDD_CORE) U1.H12(VDD_CORE) U1.H13(VDD_CORE) U1.H14(VDD_CORE) U1.H15(VDD_CORE) U1.H16(VDD_CORE) U1.H17(VDDR_CORE) U1.H18(VDDR_CORE) U1.J12(VDD_CORE) U1.J13(VDD_CORE) U1.J16(VDD_CORE) U1.J17(VDDR_CORE) U1.J18(VDDR_CORE) U1.K12(VDD_CORE) U1.K13(VDD_CORE) U1.K16(VDD_CORE) U1.K17(VDDR_CORE) U1.K18(VDDR_CORE) U1.L13(VDD_CORE) U1.L14(VDD_CORE) U1.L15(VDD_CORE) U1.L17(VDDR_CORE) U1.L18(VDDR_CORE)
VDDA_1V8_MCU: C322.1 C323.1 FB303.2 U1.F13(VDDA_MCU) U1.N12(VDDA_TEMP)
VDDSHV5_SD: TP311.1(TP) U1.G21(VDDSHV5) U1.G22(VDDSHV5)
VPP_EFUSE_1V8: C358.1 C359.1 C360.1 U1.C16(VPP)
VSYS_PD: TP300.1(TP)
DDR4_VPP_2V5: FB302.1
DDR4_VPP_2V5_SIP: C321.1 FB302.2 TP307.1(TP) U1.N10(DDR_VPP)
VDDA_1V8: FB303.1 FB304.1 FB305.1 FB306.1 FB307.1 FB308.1 FB309.1 FB310.1 TP309.1(TP)
VDDA_1V8_CSI: C330.1 C331.1 FB307.2 U1.P13(VDDA_1P8_CSIRX0)
VDDA_1V8_OLDI: C334.1 C335.1 FB308.2 U1.P11(VDDA_1P8_OLDI0)
VDDA_1V8_PLL0: C324.1 C325.1 FB304.2 U1.N13(VDDA_PLL0)
VDDA_1V8_PLL1: C326.1 C327.1 FB305.2 U1.N14(VDDA_PLL1)
VDDA_1V8_PLL2: C328.1 C329.1 FB306.2 U1.F14(VDDA_PLL2)
VDDA_1V8_USB: C332.1 C333.1 FB309.2 U1.P12(VDDA_1P8_USB)
VDDA_3P3_USB: C339.1 FB311.2 U1.N7(VDDA_3P3_USB)
VDDA_CORE_CSI_0V85: C310.1 C311.1 FB301.2 U1.M13(VDDA_CORE_CSIRX0)
VDDA_CORE_USB_0V85: C308.1 C309.1 FB300.2 U1.M12(VDDA_CORE_USB)
VDDS_DDR_1V2: C318.1 C319.1 C320.1 TP306.1(TP) U1.K10(VDDS_DDR) U1.K11(VDDS_DDR) U1.L9(VDDS_DDR) U1.L10(VDDS_DDR) U1.L11(VDDS_DDR) U1.M8(VDDS_DDR) U1.M9(VDDS_DDR) U1.M10(VDDS_DDR) U1.N8(VDDS_DDR) U1.N9(VDDS_DDR)
VDDS_OSC0_1V8: FB310.2 TP310.1(TP) U1.D15(VDDS_OSC0)
VMON_VSYS: C300.1 R301.2 R302.1 U1.A15(VMON_VSYS)

### Notes on the sheet
- * Decoupling per OSD62x-PM DS Rev 2.0 Table 4-3. Caps may sit on either side; none needed under the BGA.
- * VDD_CORE and VDDA_CORE_USB must stay within 1% - keep the beads and their traces low-resistance.
- * IO banks: VDDSHV0/2/3/MCU/CANUART = VCC_3V3_SYS, VDDSHV1/4/6 = VDD_1V8 (no links).

### Library data of the parts
C300 = CAP: Capacitor, non-polarized; Spec: 22pF 50V C0G 0402 (C1)
C301 = CAP: Capacitor, non-polarized; Spec: 10uF 10V X5R 0603
C302-C307 C309 C311 C314-C321 C323 C325 C327 C329 C331 C333 C335 = CAP: Capacitor, non-polarized; Spec: 100nF 16V X7R 0402
C308 C310 C330 C332 = CAP: Capacitor, non-polarized; Spec: 4.7uF 10V X5R 0402
C312 = CAP: Capacitor, non-polarized; Spec: 4.7uF 10V X5R 0402 (VDD_CANUART ball)
C313 = CAP: Capacitor, non-polarized; Spec: 100nF 16V X7R 0402 (VDD_CANUART ball)
C322 C324 C326 C328 C334 = CAP: Capacitor, non-polarized; Spec: 1uF 10V X5R 0402
C339 = CAP: Capacitor, non-polarized; Spec: 100nF 16V X7R 0402 (VDDA_3P3_USB)
C358 C359 = CAP: Capacitor, non-polarized; DNP: 1; Spec: 1uF 10V X5R 0402 (VPP, DNP)
C360 = CAP: Capacitor, non-polarized; DNP: 1; Spec: 100nF 16V X7R 0402 (VPP, DNP)
FB300 FB301 = FERRITE: Ferrite bead; Spec: BLM18SG260TN1D 26R@100MHz 6A
FB302-FB309 = FERRITE: Ferrite bead; Spec: BLM15PX121SN1D 120R@100MHz 2A
FB310 = FERRITE: Ferrite bead; Spec: BLM15PX121SN1D 120R@100MHz 2A (VDDS_OSC0, 25 MHz osc, PORz gate)
FB311 = FERRITE: Ferrite bead; Spec: BLM15PX121SN1D 120R@100MHz 2A (62_POWER_4 group 5)
R301 = RES: Resistor; MPN: 0402WGF4022TCE; Manufacturer: UNI-ROYAL; Spec: 40.2k 1% 0402 (R2); LCSC: C25893
R302 = RES: Resistor; MPN: 0402WGF4871TCE; Manufacturer: UNI-ROYAL; Spec: 4.87k 1% 0402 (R1); LCSC: C25902
TP300-TP312 = TESTPOINT: Test point
U1 = OSD6254-1G-IPM: Octavo OSD6254 SiP: TI AM6254 + 1 GB DDR4, 9x14 mm 500-ball 0.5 mm BGA; Manufacturer: Octavo Systems; MPN: OSD6254-1G-IPM

## Sheet 04_SiP_GND_NC.SchDoc
size 508 x 381 mm; SheetNumber: 4; SheetTotal: 16
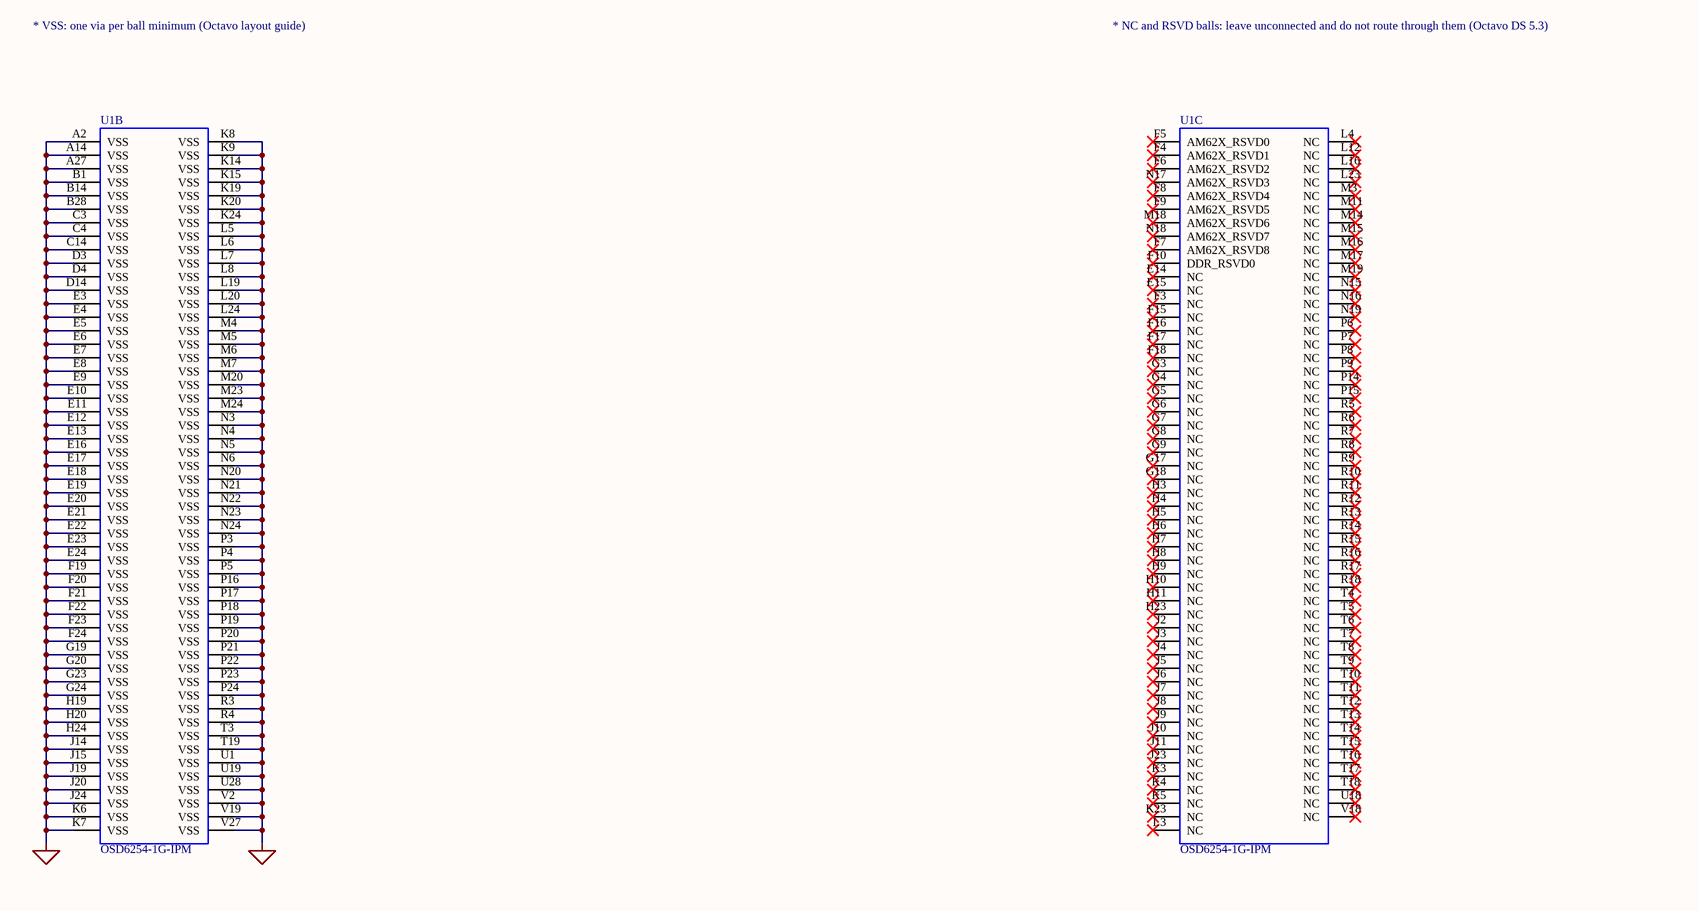
[diagram p4: 04_SiP_GND_NC.SchDoc]

### Parts
U1  OSD6254-1G-IPM  [OSD62X-PM_BGA500]  (parts B,C of 9)

### Nets
GND: U1.A2(VSS) U1.A14(VSS) U1.A27(VSS) U1.B1(VSS) U1.B14(VSS) U1.B28(VSS) U1.C3(VSS) U1.C4(VSS) U1.C14(VSS) U1.D3(VSS) U1.D4(VSS) U1.D14(VSS) U1.E3(VSS) U1.E4(VSS) U1.E5(VSS) U1.E6(VSS) U1.E7(VSS) U1.E8(VSS) U1.E9(VSS) U1.E10(VSS) U1.E11(VSS) U1.E12(VSS) U1.E13(VSS) U1.E16(VSS) U1.E17(VSS) U1.E18(VSS) U1.E19(VSS) U1.E20(VSS) U1.E21(VSS) U1.E22(VSS) U1.E23(VSS) U1.E24(VSS) U1.F19(VSS) U1.F20(VSS) U1.F21(VSS) U1.F22(VSS) U1.F23(VSS) U1.F24(VSS) U1.G19(VSS) U1.G20(VSS) U1.G23(VSS) U1.G24(VSS) U1.H19(VSS) U1.H20(VSS) U1.H24(VSS) U1.J14(VSS) U1.J15(VSS) U1.J19(VSS) U1.J20(VSS) U1.J24(VSS) U1.K6(VSS) U1.K7(VSS) U1.K8(VSS) U1.K9(VSS) U1.K14(VSS) U1.K15(VSS) U1.K19(VSS) U1.K20(VSS) U1.K24(VSS) U1.L5(VSS) U1.L6(VSS) U1.L7(VSS) U1.L8(VSS) U1.L19(VSS) U1.L20(VSS) U1.L24(VSS) U1.M4(VSS) U1.M5(VSS) U1.M6(VSS) U1.M7(VSS) U1.M20(VSS) U1.M23(VSS) U1.M24(VSS) U1.N3(VSS) U1.N4(VSS) U1.N5(VSS) U1.N6(VSS) U1.N20(VSS) U1.N21(VSS) U1.N22(VSS) U1.N23(VSS) U1.N24(VSS) U1.P3(VSS) U1.P4(VSS) U1.P5(VSS) U1.P16(VSS) U1.P17(VSS) U1.P18(VSS) U1.P19(VSS) U1.P20(VSS) U1.P21(VSS) U1.P22(VSS) U1.P23(VSS) U1.P24(VSS) U1.R3(VSS) U1.R4(VSS) U1.T3(VSS) U1.T19(VSS) U1.U1(VSS) U1.U19(VSS) U1.U28(VSS) U1.V2(VSS) U1.V19(VSS) U1.V27(VSS)

Not connected (* = marked no-connect by the designer): U1 E14(NC)* E15(NC)* F3(NC)* F4(AM62X_RSVD1)* F5(AM62X_RSVD0)* F6(AM62X_RSVD2)* F7(AM62X_RSVD8)* F8(AM62X_RSVD4)* F9(AM62X_RSVD5)* F10(DDR_RSVD0)* F15(NC)* F16(NC)* F17(NC)* F18(NC)* G3(NC)* G4(NC)* G5(NC)* G6(NC)* G7(NC)* G8(NC)* G9(NC)* G17(NC)* G18(NC)* H3(NC)* H4(NC)* H5(NC)* H6(NC)* H7(NC)* H8(NC)* H9(NC)* H10(NC)* H11(NC)* H23(NC)* J2(NC)* J3(NC)* J4(NC)* J5(NC)* J6(NC)* J7(NC)* J8(NC)* J9(NC)* J10(NC)* J11(NC)* J23(NC)* K3(NC)* K4(NC)* K5(NC)* K23(NC)* L3(NC)* L4(NC)* L12(NC)* L16(NC)* L23(NC)* M3(NC)* M11(NC)* M14(NC)* M15(NC)* M16(NC)* M17(NC)* M18(AM62X_RSVD6)* M19(NC)* N15(NC)* N16(NC)* N17(AM62X_RSVD3)* N18(AM62X_RSVD7)* N19(NC)* P6(NC)* P7(NC)* P8(NC)* P9(NC)* P14(NC)* P15(NC)* R5(NC)* R6(NC)* R7(NC)* R8(NC)* R9(NC)* R10(NC)* R11(NC)* R12(NC)* R13(NC)* R14(NC)* R15(NC)* R16(NC)* R17(NC)* R18(NC)* T4(NC)* T5(NC)* T6(NC)* T7(NC)* T8(NC)* T9(NC)* T10(NC)* T11(NC)* T12(NC)* T13(NC)* T14(NC)* T15(NC)* T16(NC)* T17(NC)* T18(NC)* U18(NC)* V18(NC)*

### Notes on the sheet
- * VSS: one via per ball minimum (Octavo layout guide)
- * NC and RSVD balls: leave unconnected and do not route through them (Octavo DS 5.3)

### Library data of the parts
U1 = OSD6254-1G-IPM: Octavo OSD6254 SiP: TI AM6254 + 1 GB DDR4, 9x14 mm 500-ball 0.5 mm BGA

## Sheet 05_SiP_IO.SchDoc
size 812 x 508 mm; SheetNumber: 5; SheetTotal: 16
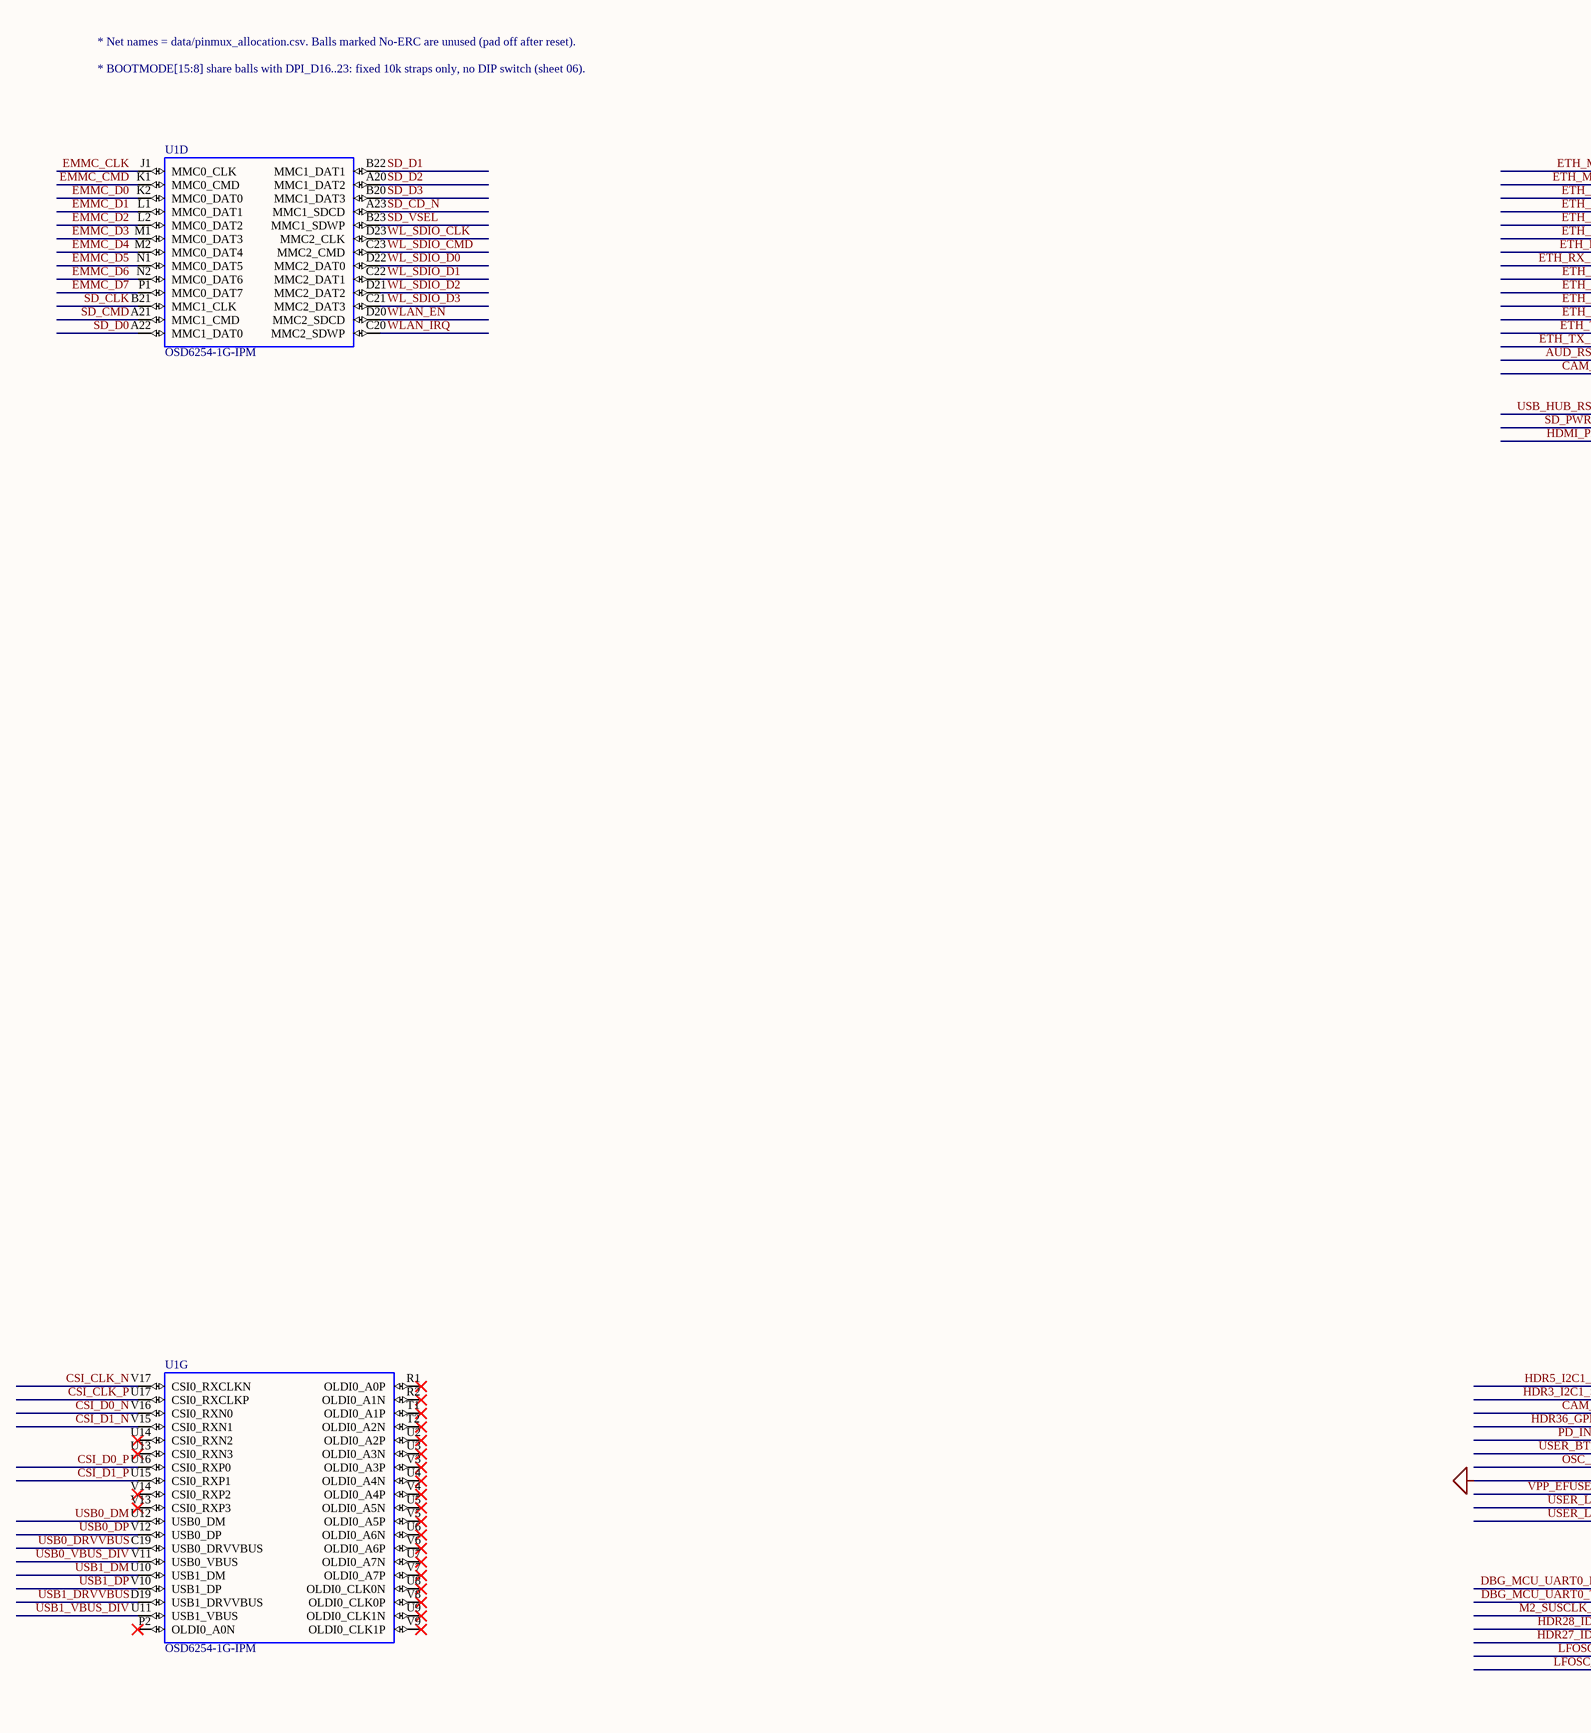
[diagram p5: 05_SiP_IO.SchDoc, left]
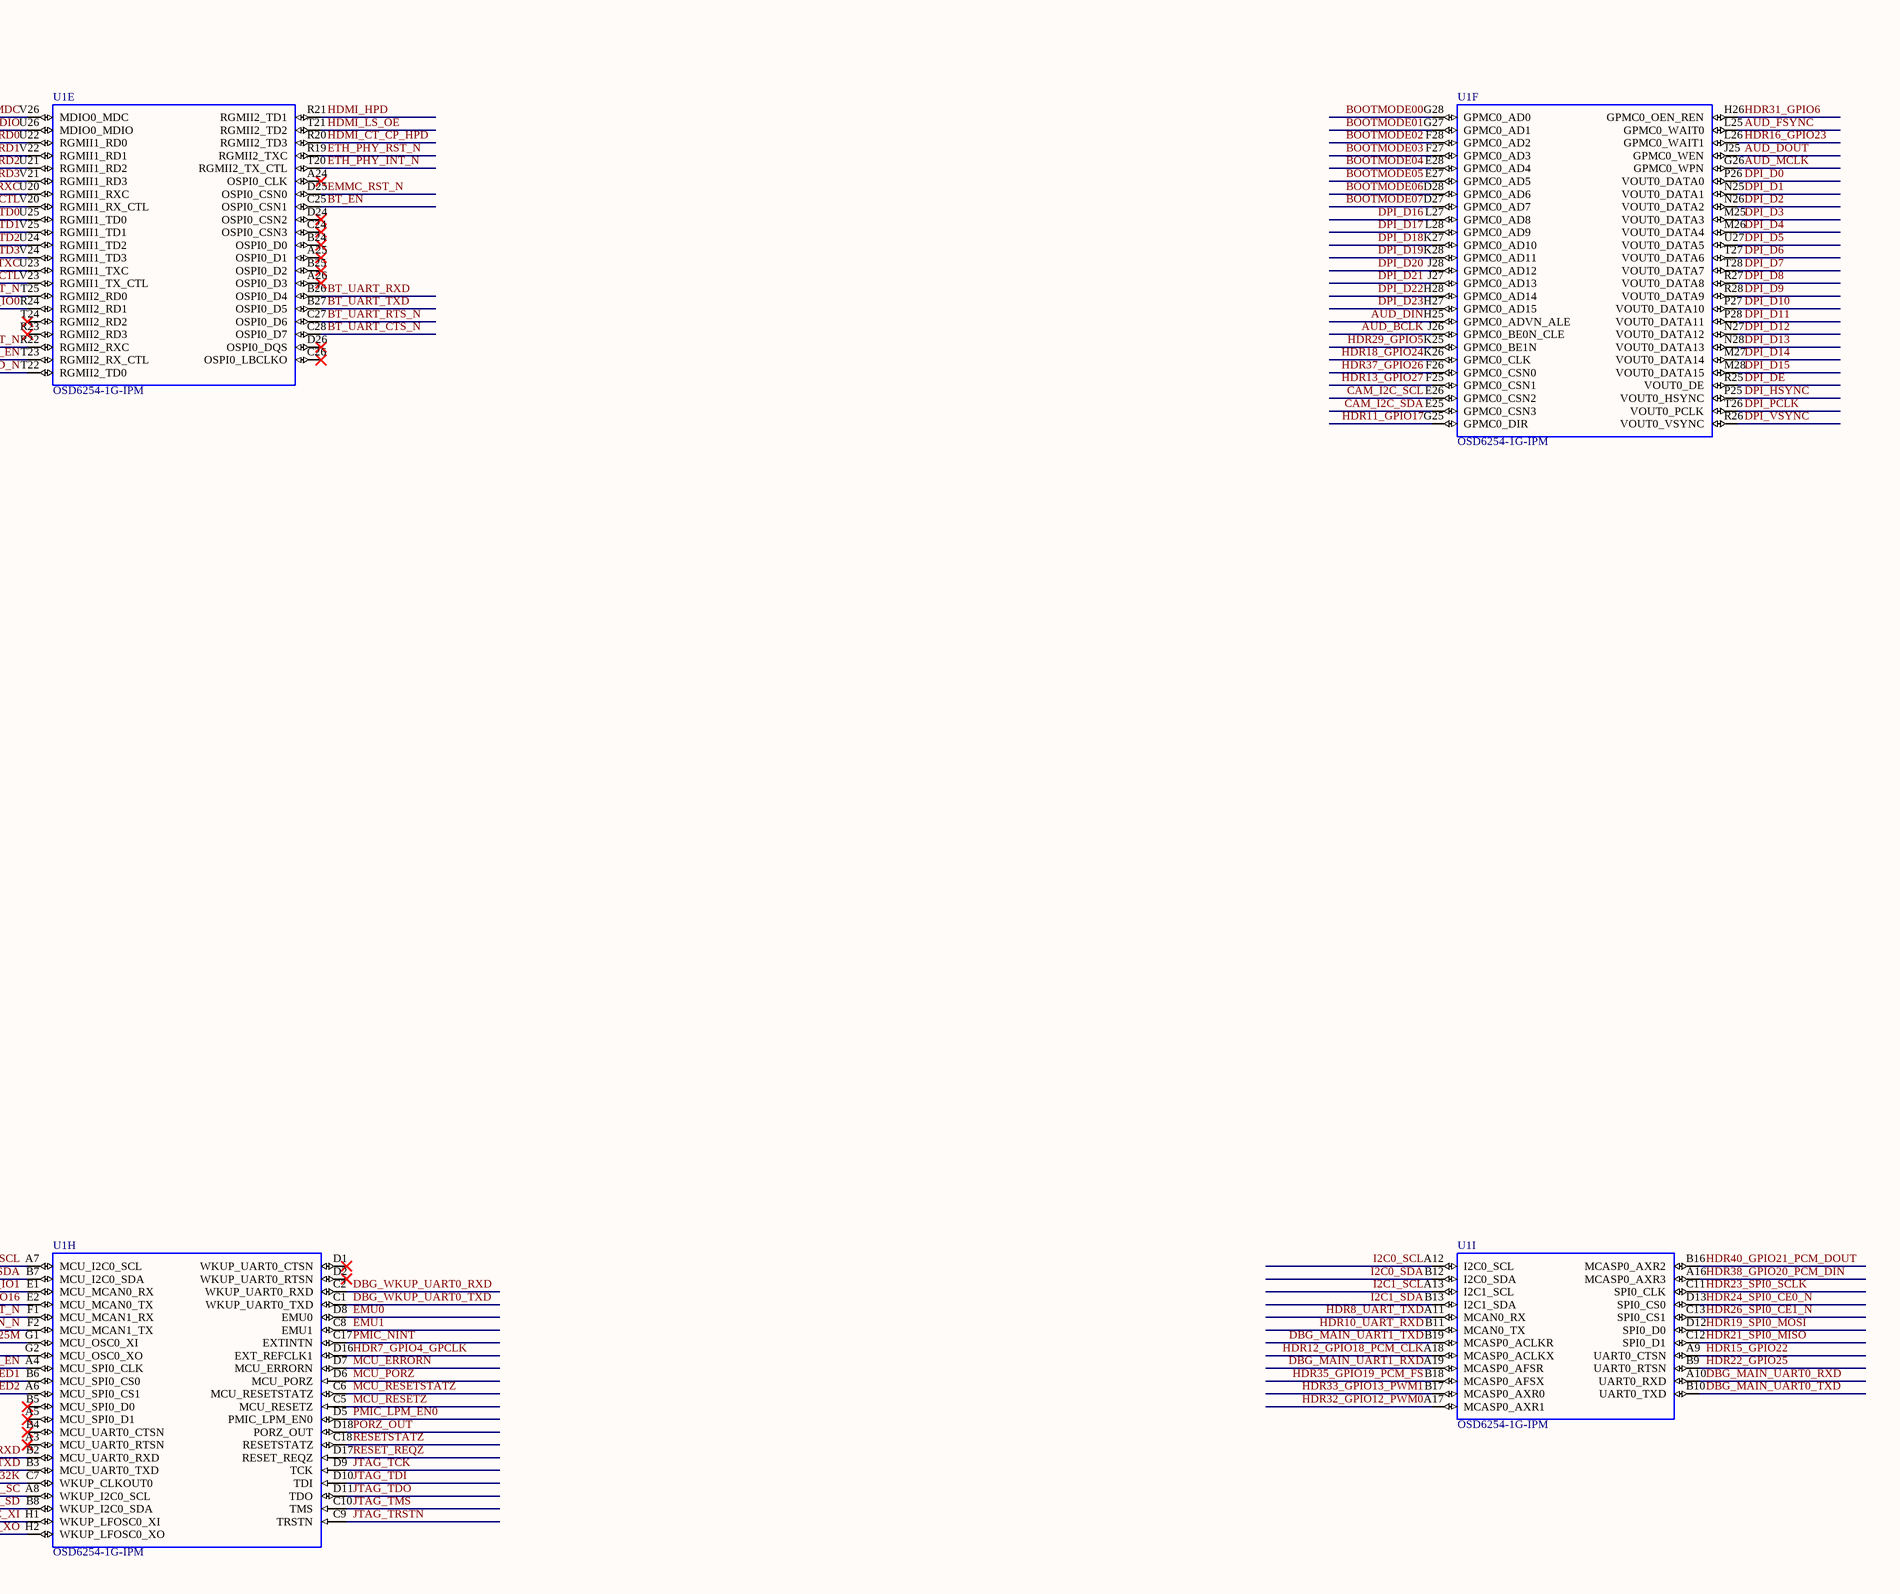
[diagram p6: 05_SiP_IO.SchDoc, right]

### Parts
U1  OSD6254-1G-IPM  [OSD62X-PM_BGA500]  (parts D,E,F,G,H,I of 9)

### Nets
GND: U1.G2(MCU_OSC0_XO)
AUD_BCLK: U1.J26(GPMC0_BE0N_CLE)
AUD_DIN: U1.H25(GPMC0_ADVN_ALE)
AUD_DOUT: U1.J25(GPMC0_WEN)
AUD_FSYNC: U1.L25(GPMC0_WAIT0)
AUD_MCLK: U1.G26(GPMC0_WPN)
AUD_RST_N: U1.T25(RGMII2_RD0)
BOOTMODE00: U1.G28(GPMC0_AD0)
BOOTMODE01: U1.G27(GPMC0_AD1)
BOOTMODE02: U1.F28(GPMC0_AD2)
BOOTMODE03: U1.F27(GPMC0_AD3)
BOOTMODE04: U1.E28(GPMC0_AD4)
BOOTMODE05: U1.E27(GPMC0_AD5)
BOOTMODE06: U1.D28(GPMC0_AD6)
BOOTMODE07: U1.D27(GPMC0_AD7)
BT_EN: U1.C25(OSPI0_CSN1)
BT_UART_CTS_N: U1.C28(OSPI0_D7)
BT_UART_RTS_N: U1.C27(OSPI0_D6)
BT_UART_RXD: U1.B26(OSPI0_D4)
BT_UART_TXD: U1.B27(OSPI0_D5)
CAM_I2C_SCL: U1.E26(GPMC0_CSN2)
CAM_I2C_SDA: U1.E25(GPMC0_CSN3)
CAM_IO0: U1.R24(RGMII2_RD1)
CAM_IO1: U1.E1(MCU_MCAN0_RX)
CSI_CLK_N: U1.V17(CSI0_RXCLKN)
CSI_CLK_P: U1.U17(CSI0_RXCLKP)
CSI_D0_N: U1.V16(CSI0_RXN0)
CSI_D0_P: U1.U16(CSI0_RXP0)
CSI_D1_N: U1.V15(CSI0_RXN1)
CSI_D1_P: U1.U15(CSI0_RXP1)
DBG_MAIN_UART0_RXD: U1.A10(UART0_RXD)
DBG_MAIN_UART0_TXD: U1.B10(UART0_TXD)
DBG_MAIN_UART1_RXD: U1.A19(MCASP0_AFSR)
DBG_MAIN_UART1_TXD: U1.B19(MCASP0_ACLKR)
DBG_MCU_UART0_RXD: U1.B2(MCU_UART0_RXD)
DBG_MCU_UART0_TXD: U1.B3(MCU_UART0_TXD)
DBG_WKUP_UART0_RXD: U1.C2(WKUP_UART0_RXD)
DBG_WKUP_UART0_TXD: U1.C1(WKUP_UART0_TXD)
DPI_D0: U1.P26(VOUT0_DATA0)
DPI_D1: U1.N25(VOUT0_DATA1)
DPI_D2: U1.N26(VOUT0_DATA2)
DPI_D3: U1.M25(VOUT0_DATA3)
DPI_D4: U1.M26(VOUT0_DATA4)
DPI_D5: U1.U27(VOUT0_DATA5)
DPI_D6: U1.T27(VOUT0_DATA6)
DPI_D7: U1.T28(VOUT0_DATA7)
DPI_D8: U1.R27(VOUT0_DATA8)
DPI_D9: U1.R28(VOUT0_DATA9)
DPI_D10: U1.P27(VOUT0_DATA10)
DPI_D11: U1.P28(VOUT0_DATA11)
DPI_D12: U1.N27(VOUT0_DATA12)
DPI_D13: U1.N28(VOUT0_DATA13)
DPI_D14: U1.M27(VOUT0_DATA14)
DPI_D15: U1.M28(VOUT0_DATA15)
DPI_D16: U1.L27(GPMC0_AD8)
DPI_D17: U1.L28(GPMC0_AD9)
DPI_D18: U1.K27(GPMC0_AD10)
DPI_D19: U1.K28(GPMC0_AD11)
DPI_D20: U1.J28(GPMC0_AD12)
DPI_D21: U1.J27(GPMC0_AD13)
DPI_D22: U1.H28(GPMC0_AD14)
DPI_D23: U1.H27(GPMC0_AD15)
DPI_DE: U1.R25(VOUT0_DE)
DPI_HSYNC: U1.P25(VOUT0_HSYNC)
DPI_PCLK: U1.T26(VOUT0_PCLK)
DPI_VSYNC: U1.R26(VOUT0_VSYNC)
EMMC_CLK: U1.J1(MMC0_CLK)
EMMC_CMD: U1.K1(MMC0_CMD)
EMMC_D0: U1.K2(MMC0_DAT0)
EMMC_D1: U1.L1(MMC0_DAT1)
EMMC_D2: U1.L2(MMC0_DAT2)
EMMC_D3: U1.M1(MMC0_DAT3)
EMMC_D4: U1.M2(MMC0_DAT4)
EMMC_D5: U1.N1(MMC0_DAT5)
EMMC_D6: U1.N2(MMC0_DAT6)
EMMC_D7: U1.P1(MMC0_DAT7)
EMMC_RST_N: U1.D25(OSPI0_CSN0)
EMU0: U1.D8(EMU0)
EMU1: U1.C8(EMU1)
ETH_MDC: U1.V26(MDIO0_MDC)
ETH_MDIO: U1.U26(MDIO0_MDIO)
ETH_PHY_INT_N: U1.T20(RGMII2_TX_CTL)
ETH_PHY_RST_N: U1.R19(RGMII2_TXC)
ETH_RD0: U1.U22(RGMII1_RD0)
ETH_RD1: U1.V22(RGMII1_RD1)
ETH_RD2: U1.U21(RGMII1_RD2)
ETH_RD3: U1.V21(RGMII1_RD3)
ETH_RX_CTL: U1.V20(RGMII1_RX_CTL)
ETH_RXC: U1.U20(RGMII1_RXC)
ETH_TD0: U1.U25(RGMII1_TD0)
ETH_TD1: U1.V25(RGMII1_TD1)
ETH_TD2: U1.U24(RGMII1_TD2)
ETH_TD3: U1.V24(RGMII1_TD3)
ETH_TX_CTL: U1.V23(RGMII1_TX_CTL)
ETH_TXC: U1.U23(RGMII1_TXC)
HDMI_CT_CP_HPD: U1.R20(RGMII2_TD3)
HDMI_HPD: U1.R21(RGMII2_TD1)
HDMI_LS_OE: U1.T21(RGMII2_TD2)
HDMI_PD_N: U1.T22(RGMII2_TD0)
HDR3_I2C1_SDA: U1.B7(MCU_I2C0_SDA)
HDR5_I2C1_SCL: U1.A7(MCU_I2C0_SCL)
HDR7_GPIO4_GPCLK: U1.D16(EXT_REFCLK1)
HDR8_UART_TXD: U1.A11(MCAN0_RX)
HDR10_UART_RXD: U1.B11(MCAN0_TX)
HDR11_GPIO17: U1.G25(GPMC0_DIR)
HDR12_GPIO18_PCM_CLK: U1.A18(MCASP0_ACLKX)
HDR13_GPIO27: U1.F25(GPMC0_CSN1)
HDR15_GPIO22: U1.A9(UART0_CTSN)
HDR16_GPIO23: U1.L26(GPMC0_WAIT1)
HDR18_GPIO24: U1.K26(GPMC0_CLK)
HDR19_SPI0_MOSI: U1.D12(SPI0_D0)
HDR21_SPI0_MISO: U1.C12(SPI0_D1)
HDR22_GPIO25: U1.B9(UART0_RTSN)
HDR23_SPI0_SCLK: U1.C11(SPI0_CLK)
HDR24_SPI0_CE0_N: U1.D13(SPI0_CS0)
HDR26_SPI0_CE1_N: U1.C13(SPI0_CS1)
HDR27_ID_SD: U1.B8(WKUP_I2C0_SDA)
HDR28_ID_SC: U1.A8(WKUP_I2C0_SCL)
HDR29_GPIO5: U1.K25(GPMC0_BE1N)
HDR31_GPIO6: U1.H26(GPMC0_OEN_REN)
HDR32_GPIO12_PWM0: U1.A17(MCASP0_AXR1)
HDR33_GPIO13_PWM1: U1.B17(MCASP0_AXR0)
HDR35_GPIO19_PCM_FS: U1.B18(MCASP0_AFSX)
HDR36_GPIO16: U1.E2(MCU_MCAN0_TX)
HDR37_GPIO26: U1.F26(GPMC0_CSN0)
HDR38_GPIO20_PCM_DIN: U1.A16(MCASP0_AXR3)
HDR40_GPIO21_PCM_DOUT: U1.B16(MCASP0_AXR2)
I2C0_SCL: U1.A12(I2C0_SCL)
I2C0_SDA: U1.B12(I2C0_SDA)
I2C1_SCL: U1.A13(I2C1_SCL)
I2C1_SDA: U1.B13(I2C1_SDA)
JTAG_TCK: U1.D9(TCK)
JTAG_TDI: U1.D10(TDI)
JTAG_TDO: U1.D11(TDO)
JTAG_TMS: U1.C10(TMS)
JTAG_TRSTN: U1.C9(TRSTN)
LFOSC_XI: U1.H1(WKUP_LFOSC0_XI)
LFOSC_XO: U1.H2(WKUP_LFOSC0_XO)
M2_SUSCLK_32K: U1.C7(WKUP_CLKOUT0)
MCU_ERRORN: U1.D7(MCU_ERRORN)
MCU_PORZ: U1.D6(MCU_PORZ)
MCU_RESETSTATZ: U1.C6(MCU_RESETSTATZ)
MCU_RESETZ: U1.C5(MCU_RESETZ)
OSC_25M: U1.G1(MCU_OSC0_XI)
PD_INT_N: U1.F1(MCU_MCAN1_RX)
PMIC_LPM_EN0: U1.D5(PMIC_LPM_EN0)
PMIC_NINT: U1.C17(EXTINTN)
PORZ_OUT: U1.D18(PORZ_OUT)
RESET_REQZ: U1.D17(RESET_REQZ)
RESETSTATZ: U1.C18(RESETSTATZ)
SD_CD_N: U1.A23(MMC1_SDCD)
SD_CLK: U1.B21(MMC1_CLK)
SD_CMD: U1.A21(MMC1_CMD)
SD_D0: U1.A22(MMC1_DAT0)
SD_D1: U1.B22(MMC1_DAT1)
SD_D2: U1.A20(MMC1_DAT2)
SD_D3: U1.B20(MMC1_DAT3)
SD_PWR_EN: U1.T23(RGMII2_RX_CTL)
SD_VSEL: U1.B23(MMC1_SDWP)
USB0_DM: U1.U12(USB0_DM)
USB0_DP: U1.V12(USB0_DP)
USB0_DRVVBUS: U1.C19(USB0_DRVVBUS)
USB0_VBUS_DIV: U1.V11(USB0_VBUS)
USB1_DM: U1.U10(USB1_DM)
USB1_DP: U1.V10(USB1_DP)
USB1_DRVVBUS: U1.D19(USB1_DRVVBUS)
USB1_VBUS_DIV: U1.U11(USB1_VBUS)
USB_HUB_RST_N: U1.R22(RGMII2_RXC)
USER_BTN_N: U1.F2(MCU_MCAN1_TX)
USER_LED1: U1.B6(MCU_SPI0_CS0)
USER_LED2: U1.A6(MCU_SPI0_CS1)
VPP_EFUSE_EN: U1.A4(MCU_SPI0_CLK)
WL_SDIO_CLK: U1.D23(MMC2_CLK)
WL_SDIO_CMD: U1.C23(MMC2_CMD)
WL_SDIO_D0: U1.D22(MMC2_DAT0)
WL_SDIO_D1: U1.C22(MMC2_DAT1)
WL_SDIO_D2: U1.D21(MMC2_DAT2)
WL_SDIO_D3: U1.C21(MMC2_DAT3)
WLAN_EN: U1.D20(MMC2_SDCD)
WLAN_IRQ: U1.C20(MMC2_SDWP)

Not connected (* = marked no-connect by the designer): U1 A3(MCU_UART0_RTSN)* A5(MCU_SPI0_D1)* A24(OSPI0_CLK)* A25(OSPI0_D1)* A26(OSPI0_D3)* B4(MCU_UART0_CTSN)* B5(MCU_SPI0_D0)* B24(OSPI0_D0)* B25(OSPI0_D2)* C24(OSPI0_CSN3)* C26(OSPI0_LBCLKO)* D1(WKUP_UART0_CTSN)* D2(WKUP_UART0_RTSN)* D24(OSPI0_CSN2)* D26(OSPI0_DQS)* P2(OLDI0_A0N)* R1(OLDI0_A0P)* R2(OLDI0_A1N)* R23(RGMII2_RD3)* T1(OLDI0_A1P)* T2(OLDI0_A2N)* T24(RGMII2_RD2)* U2(OLDI0_A2P)* U3(OLDI0_A3N)* U4(OLDI0_A4N)* U5(OLDI0_A5N)* U6(OLDI0_A6N)* U7(OLDI0_A7N)* U8(OLDI0_CLK0N)* U9(OLDI0_CLK1N)* U13(CSI0_RXN3)* U14(CSI0_RXN2)* V3(OLDI0_A3P)* V4(OLDI0_A4P)* V5(OLDI0_A5P)* V6(OLDI0_A6P)* V7(OLDI0_A7P)* V8(OLDI0_CLK0P)* V9(OLDI0_CLK1P)* V13(CSI0_RXP3)* V14(CSI0_RXP2)*

### Notes on the sheet
- * Net names = data/pinmux_allocation.csv. Balls marked No-ERC are unused (pad off after reset).
- * BOOTMODE[15:8] share balls with DPI_D16..23: fixed 10k straps only, no DIP switch (sheet 06).

### Library data of the parts
U1 = OSD6254-1G-IPM: as U1 on sheet 04_SiP_GND_NC

## Sheet 06_Clock_Reset_Boot.SchDoc
size 812 x 508 mm; SheetNumber: 6; SheetTotal: 16
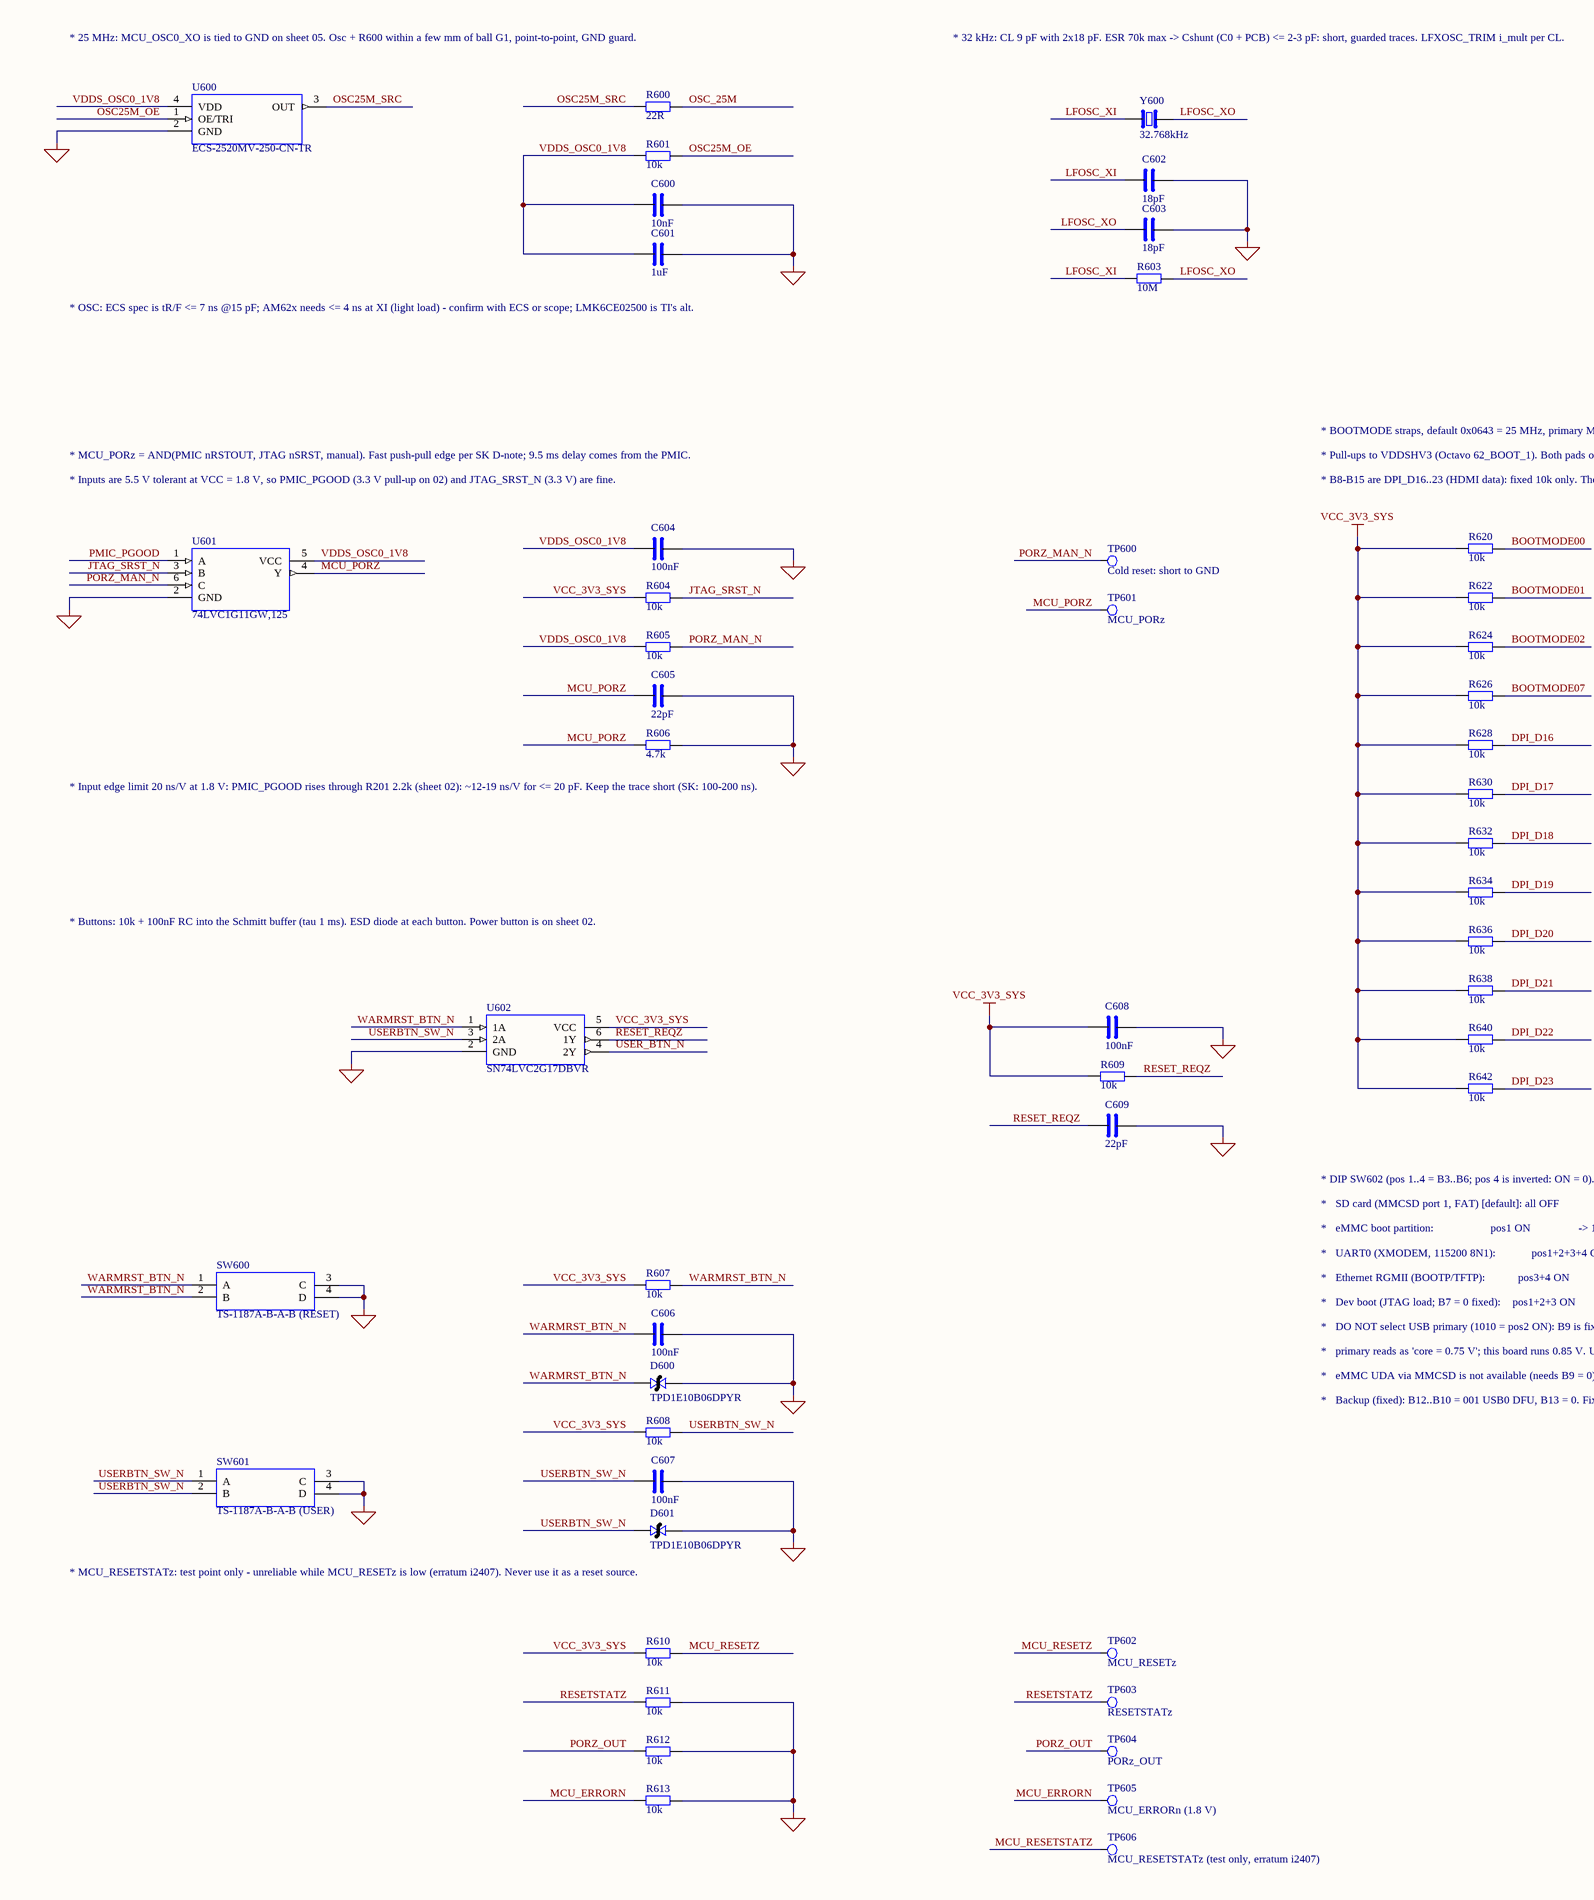
[diagram p7: 06_Clock_Reset_Boot.SchDoc, left]
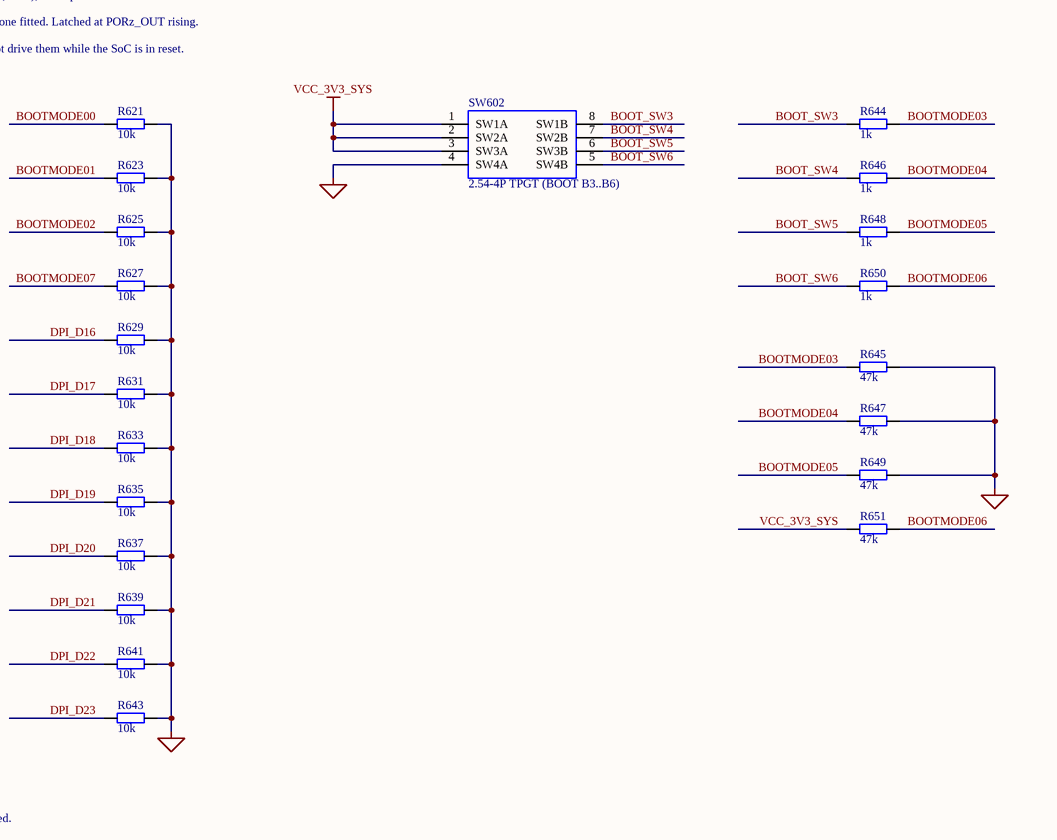
[diagram p8: 06_Clock_Reset_Boot.SchDoc, right]

### Parts
C600  10nF  [C0402]
C601  1uF  [C0402]
C602  18pF  [C0402]
C603  18pF  [C0402]
C604  100nF  [C0402]
C605  22pF  [C0402]
C606  100nF  [C0402]
C607  100nF  [C0402]
C608  100nF  [C0402]
C609  22pF  [C0402]
D600  TPD1E10B06DPYR  [X1SON2_DPY]
D601  TPD1E10B06DPYR  [X1SON2_DPY]
R600  22R  [R0402]
R601  10k  [R0402]
R603  10M  [R0402]
R604  10k  [R0402]
R605  10k  [R0402]
R606  4.7k  [R0402]
R607  10k  [R0402]
R608  10k  [R0402]
R609  10k  [R0402]
R610  10k  [R0402]
R611  10k  [R0402]
R612  10k  [R0402]
R613  10k  [R0402]
R620  10k  [R0402]
R621  10k  [R0402]
R622  10k  [R0402]
R623  10k  [R0402]
R624  10k  [R0402]
R625  10k  [R0402]
R626  10k  [R0402]
R627  10k  [R0402]
R628  10k  [R0402]
R629  10k  [R0402]
R630  10k  [R0402]
R631  10k  [R0402]
R632  10k  [R0402]
R633  10k  [R0402]
R634  10k  [R0402]
R635  10k  [R0402]
R636  10k  [R0402]
R637  10k  [R0402]
R638  10k  [R0402]
R639  10k  [R0402]
R640  10k  [R0402]
R641  10k  [R0402]
R642  10k  [R0402]
R643  10k  [R0402]
R644  1k  [R0402]
R645  47k  [R0402]
R646  1k  [R0402]
R647  47k  [R0402]
R648  1k  [R0402]
R649  47k  [R0402]
R650  1k  [R0402]
R651  47k  [R0402]
SW600  TS-1187A-B-A-B (RESET)  [SW_TACT_5.1X5.1_SMD4]
SW601  TS-1187A-B-A-B (USER)  [SW_TACT_5.1X5.1_SMD4]
SW602  2.54-4P TPGT (BOOT B3..B6)  [SW_DIP4_SMD_2.54]
TP600  Cold reset: short to GND  [TP_PAD_1.0]
TP601  MCU_PORz  [TP_PAD_1.0]
TP602  MCU_RESETz  [TP_PAD_1.0]
TP603  RESETSTATz  [TP_PAD_1.0]
TP604  PORz_OUT  [TP_PAD_1.0]
TP605  MCU_ERRORn (1.8 V)  [TP_PAD_1.0]
TP606  MCU_RESETSTATz (test only, erratum i2407)  [TP_PAD_1.0]
U600  ECS-2520MV-250-CN-TR  [OSC_2520_4P]
U601  74LVC1G11GW,125  [SC70-6]
U602  SN74LVC2G17DBVR  [SOT23-6]
Y600  32.768kHz  [XTAL_EPSON_FC-135]

### Nets
GND: C600.2 C601.2 C602.2 C603.2 C604.2 C605.2 C606.2 C607.2 C608.2 C609.2 D600.2 D601.2 R606.2 R611.2 R612.2 R613.2 R621.2 R623.2 R625.2 R627.2 R629.2 R631.2 R633.2 R635.2 R637.2 R639.2 R641.2 R643.2 R645.2 R647.2 R649.2 SW600.3(C) SW600.4(D) SW601.3(C) SW601.4(D) SW602.4(SW4A) U600.2(GND) U601.2(GND) U602.2(GND)
VCC_3V3_SYS: C608.1 R604.1 R607.1 R608.1 R609.1 R610.1 R620.1 R622.1 R624.1 R626.1 R628.1 R630.1 R632.1 R634.1 R636.1 R638.1 R640.1 R642.1 R651.1 SW602.1(SW1A) SW602.2(SW2A) SW602.3(SW3A) U602.5(VCC)
BOOT_SW3: R644.1 SW602.8(SW1B)
BOOT_SW4: R646.1 SW602.7(SW2B)
BOOT_SW5: R648.1 SW602.6(SW3B)
BOOT_SW6: R650.1 SW602.5(SW4B)
BOOTMODE00: R620.2 R621.1
BOOTMODE01: R622.2 R623.1
BOOTMODE02: R624.2 R625.1
BOOTMODE03: R644.2 R645.1
BOOTMODE04: R646.2 R647.1
BOOTMODE05: R648.2 R649.1
BOOTMODE06: R650.2 R651.2
BOOTMODE07: R626.2 R627.1
DPI_D16: R628.2 R629.1
DPI_D17: R630.2 R631.1
DPI_D18: R632.2 R633.1
DPI_D19: R634.2 R635.1
DPI_D20: R636.2 R637.1
DPI_D21: R638.2 R639.1
DPI_D22: R640.2 R641.1
DPI_D23: R642.2 R643.1
JTAG_SRST_N: R604.2 U601.3(B)
LFOSC_XI: C602.1 R603.1 Y600.1
LFOSC_XO: C603.1 R603.2 Y600.2
MCU_ERRORN: R613.1 TP605.1(TP)
MCU_PORZ: C605.1 R606.1 TP601.1(TP) U601.4(Y)
MCU_RESETSTATZ: TP606.1(TP)
MCU_RESETZ: R610.2 TP602.1(TP)
OSC25M_OE: R601.2 U600.1(OE/TRI)
OSC25M_SRC: R600.1 U600.3(OUT)
OSC_25M: R600.2
PMIC_PGOOD: U601.1(A)
PORZ_MAN_N: R605.2 TP600.1(TP) U601.6(C)
PORZ_OUT: R612.1 TP604.1(TP)
RESET_REQZ: C609.1 R609.2 U602.6(1Y)
RESETSTATZ: R611.1 TP603.1(TP)
USER_BTN_N: U602.4(2Y)
USERBTN_SW_N: C607.1 D601.1 R608.2 SW601.1(A) SW601.2(B) U602.3(2A)
VDDS_OSC0_1V8: C600.1 C601.1 C604.1 R601.1 R605.1 U600.4(VDD) U601.5(VCC)
WARMRST_BTN_N: C606.1 D600.1 R607.2 SW600.1(A) SW600.2(B) U602.1(1A)

### Notes on the sheet
- * 25 MHz: MCU_OSC0_XO is tied to GND on sheet 05. Osc + R600 within a few mm of ball G1, point-to-point, GND guard.
- * 32 kHz: CL 9 pF with 2x18 pF. ESR 70k max -> Cshunt (C0 + PCB) <= 2-3 pF: short, guarded traces. LFXOSC_TRIM i_mult per CL.
- * OSC: ECS spec is tR/F <= 7 ns @15 pF; AM62x needs <= 4 ns at XI (light load) - confirm with ECS or scope; LMK6CE02500 is TI's alt.
- * BOOTMODE straps, default 0x0643 = 25 MHz, primary MMCSD port 1 (SD, FAT), backup USB DFU.
- * MCU_PORz = AND(PMIC nRSTOUT, JTAG nSRST, manual). Fast push-pull edge per SK D-note; 9.5 ms delay comes from the PMIC.
- * Inputs are 5.5 V tolerant at VCC = 1.8 V, so PMIC_PGOOD (3.3 V pull-up on 02) and JTAG_SRST_N (3.3 V) are fine.
- * Pull-ups to VDDSHV3 (Octavo 62_BOOT_1). Both pads on every fixed bit, one fitted. Latched at PORz_OUT rising.
- * B8-B15 are DPI_D16..23 (HDMI data): fixed 10k only. The TFP410 must not drive them while the SoC is in reset.
- (near R606) * Input edge limit 20 ns/V at 1.8 V: PMIC_PGOOD rises through R201 2.2k (sheet 02): ~12-19 ns/V for <= 20 pF. Keep the trace short (SK: 100-200 ns).
- * Buttons: 10k + 100nF RC into the Schmitt buffer (tau 1 ms). ESD diode at each button. Power button is on sheet 02.
- * DIP SW602 (pos 1..4 = B3..B6; pos 4 is inverted: ON = 0). OFF = as delivered.
- *   SD card (MMCSD port 1, FAT) [default]: all OFF                -> B6..B3 = 1000
- *   eMMC boot partition:                   pos1 ON                -> 1001
- *   UART0 (XMODEM, 115200 8N1):            pos1+2+3+4 ON          -> 0111
- *   Ethernet RGMII (BOOTP/TFTP):           pos3+4 ON              -> 0100 (B9=1: ROM drives 25 MHz on CLKOUT0 = ball D16 = header pin 7)
- *   Dev boot (JTAG load; B7 = 0 fixed):    pos1+2+3 ON            -> 1111 (true No-boot needs B7 = 1)
- *   DO NOT select USB primary (1010 = pos2 ON): B9 is fixed 1, which USB
- *   primary reads as 'core = 0.75 V'; this board runs 0.85 V. Use the USB DFU backup instead.
- *   eMMC UDA via MMCSD is not available (needs B9 = 0); use the eMMC boot partition mode.
- *   Backup (fixed): B12..B10 = 001 USB0 DFU, B13 = 0. Fixed: B2..B0 = 011, B7 = 0, B8 = 0, B15..B14 = 00.
- (near D601) * MCU_RESETSTATz: test point only - unreliable while MCU_RESETz is low (erratum i2407). Never use it as a reset source.

### Library data of the parts
C600 = CAP: Capacitor, non-polarized; Spec: 10nF 50V X7R 0402 (osc VDD)
C601 = CAP: Capacitor, non-polarized; Spec: 1uF 10V X5R 0402 (osc VDD)
C602 = CAP: Capacitor, non-polarized; Spec: 18pF 50V C0G 0402 (Cf1)
C603 = CAP: Capacitor, non-polarized; Spec: 18pF 50V C0G 0402 (Cf2)
C604 = CAP: Capacitor, non-polarized; Spec: 100nF 16V X7R 0402 (U601 VCC)
C605 = CAP: Capacitor, non-polarized; Spec: 22pF 50V C0G 0402 (glitch filter at ball D6)
C606 C607 = CAP: Capacitor, non-polarized; Spec: 100nF 16V X7R 0402 (debounce)
C608 = CAP: Capacitor, non-polarized; Spec: 100nF 16V X7R 0402 (U602 VCC)
C609 = CAP: Capacitor, non-polarized; Spec: 22pF 50V C0G 0402 (glitch filter at ball D17)
D600 D601 = TVS_BI: Bidirectional TVS / ESD diode; Manufacturer: Texas Instruments; MPN: TPD1E10B06DPYR
R600 = RES: Resistor; Spec: 22R 1% 0402 (series term. at the oscillator)
R601 = RES: Resistor; Spec: 10k 1% 0402 (OE pull-up, SK R370)
R603 = RES: Resistor; DNP: 1; Spec: 10M 1% 0402 (Rbias option, DS Fig 6-21 gives no value)
R604 = RES: Resistor; Spec: 10k 1% 0402 (gate enabled with no debugger)
R605 = RES: Resistor; Spec: 10k 1% 0402 (spare input high)
R606 = RES: Resistor; Spec: 4.7k 1% 0402 (SK R201; holds PORz low when U601 is unpowered)
R607 R608 = RES: Resistor; Spec: 10k 1% 0402
R609 = RES: Resistor; Spec: 10k 1% 0402 (Octavo 62_RESET_6)
R610 = RES: Resistor; Spec: 10k 1% 0402 (Octavo 62_CONFIG_4, 62_RESET_4)
R611 = RES: Resistor; Spec: 10k 1% 0402 (RESETSTATz pull-down, as SK; SoC load 0.33 mA)
R612 = RES: Resistor; Spec: 10k 1% 0402 (holds peripherals in reset)
R613 = RES: Resistor; Spec: 10k 1% 0402 (DS Table 5-74: pull-down)
R620 = RES: Resistor; Spec: 10k 1% 0402 (B0 = 1: PLL ref 011 = 25 MHz)
R621 = RES: Resistor; DNP: 1; Spec: 10k 1% 0402 DNP (B0 = 1: PLL ref 011 = 25 MHz)
R622 = RES: Resistor; Spec: 10k 1% 0402 (B1 = 1: PLL ref)
R623 = RES: Resistor; DNP: 1; Spec: 10k 1% 0402 DNP (B1 = 1: PLL ref)
R624 = RES: Resistor; DNP: 1; Spec: 10k 1% 0402 DNP (B2 = 0: PLL ref)
R625 = RES: Resistor; Spec: 10k 1% 0402 (B2 = 0: PLL ref)
R626 = RES: Resistor; DNP: 1; Spec: 10k 1% 0402 DNP (B7 = 0: MMCSD FS/raw: 0 = FAT)
R627 = RES: Resistor; Spec: 10k 1% 0402 (B7 = 0: MMCSD FS/raw: 0 = FAT)
R628 = RES: Resistor; DNP: 1; Spec: 10k 1% 0402 DNP (B8 = 0: rsvd for MMCSD)
R629 = RES: Resistor; Spec: 10k 1% 0402 (B8 = 0: rsvd for MMCSD)
R630 = RES: Resistor; Spec: 10k 1% 0402 (B9 = 1: MMCSD port: 1 = MMC1 (SD))
R631 = RES: Resistor; DNP: 1; Spec: 10k 1% 0402 DNP (B9 = 1: MMCSD port: 1 = MMC1 (SD))
R632 = RES: Resistor; Spec: 10k 1% 0402 (B10 = 1: backup 001 = USB)
R633 = RES: Resistor; DNP: 1; Spec: 10k 1% 0402 DNP (B10 = 1: backup 001 = USB)
R634 = RES: Resistor; DNP: 1; Spec: 10k 1% 0402 DNP (B11 = 0: backup)
R635 = RES: Resistor; Spec: 10k 1% 0402 (B11 = 0: backup)
R636 = RES: Resistor; DNP: 1; Spec: 10k 1% 0402 DNP (B12 = 0: backup)
R637 = RES: Resistor; Spec: 10k 1% 0402 (B12 = 0: backup)
R638 = RES: Resistor; DNP: 1; Spec: 10k 1% 0402 DNP (B13 = 0: backup USB mode: 0 = DFU)
R639 = RES: Resistor; Spec: 10k 1% 0402 (B13 = 0: backup USB mode: 0 = DFU)
R640 = RES: Resistor; DNP: 1; Spec: 10k 1% 0402 DNP (B14 = 0: reserved)
R641 = RES: Resistor; Spec: 10k 1% 0402 (B14 = 0: reserved)
R642 = RES: Resistor; DNP: 1; Spec: 10k 1% 0402 DNP (B15 = 0: reserved)
R643 = RES: Resistor; Spec: 10k 1% 0402 (B15 = 0: reserved)
R644 = RES: Resistor; Spec: 1k 1% 0402 (DIP pos 1 ON -> B3 = 1)
R645 = RES: Resistor; Spec: 47k 1% 0402 (B3 OFF = 0)
R646 = RES: Resistor; Spec: 1k 1% 0402 (DIP pos 2 ON -> B4 = 1)
R647 = RES: Resistor; Spec: 47k 1% 0402 (B4 OFF = 0)
R648 = RES: Resistor; Spec: 1k 1% 0402 (DIP pos 3 ON -> B5 = 1)
R649 = RES: Resistor; Spec: 47k 1% 0402 (B5 OFF = 0)
R650 = RES: Resistor; Spec: 1k 1% 0402 (DIP pos 4 ON -> B6 = 0)
R651 = RES: Resistor; Spec: 47k 1% 0402 (B6 OFF = 1)
SW600 SW601 = TS-1187A: as SW200 on sheet 02_PMIC; MPN: TS-1187A-B-A-B
SW602 = DIPSW4_SMD: DIP switch 4-position SPST, 2.54 mm SMD (pos k = pins k / 9-k); Manufacturer: SHOU HAN; MPN: 2.54-4P TPGT
TP600-TP606 = TESTPOINT: Test point
U600 = ECS-2520MV: 25 MHz HCMOS oscillator 1.6-3.6 V, 2.5x2.0 mm SMD-4; Manufacturer: ECS Inc; MPN: ECS-2520MV-250-CN-TR
U601 = SN74LVC1G11_DCK: Single 3-input AND gate, SC70-6; Manufacturer: Nexperia; MPN: 74LVC1G11GW,125; LCSC: C282348; Supplier: Mouser 771-LVC1G11GW125
U602 = SN74LVC2G17_DBV: Dual Schmitt-trigger buffer, SOT-23-6; Manufacturer: Texas Instruments; MPN: SN74LVC2G17DBVR
Y600 = XTAL2: Crystal, 2-terminal; MPN: Q13FC13500003; Manufacturer: Seiko Epson; Spec: 32.768kHz 9pF 20ppm Q13FC13500003